# Altium project UHF_Reader_MultiFunction_V4.PrjPcb
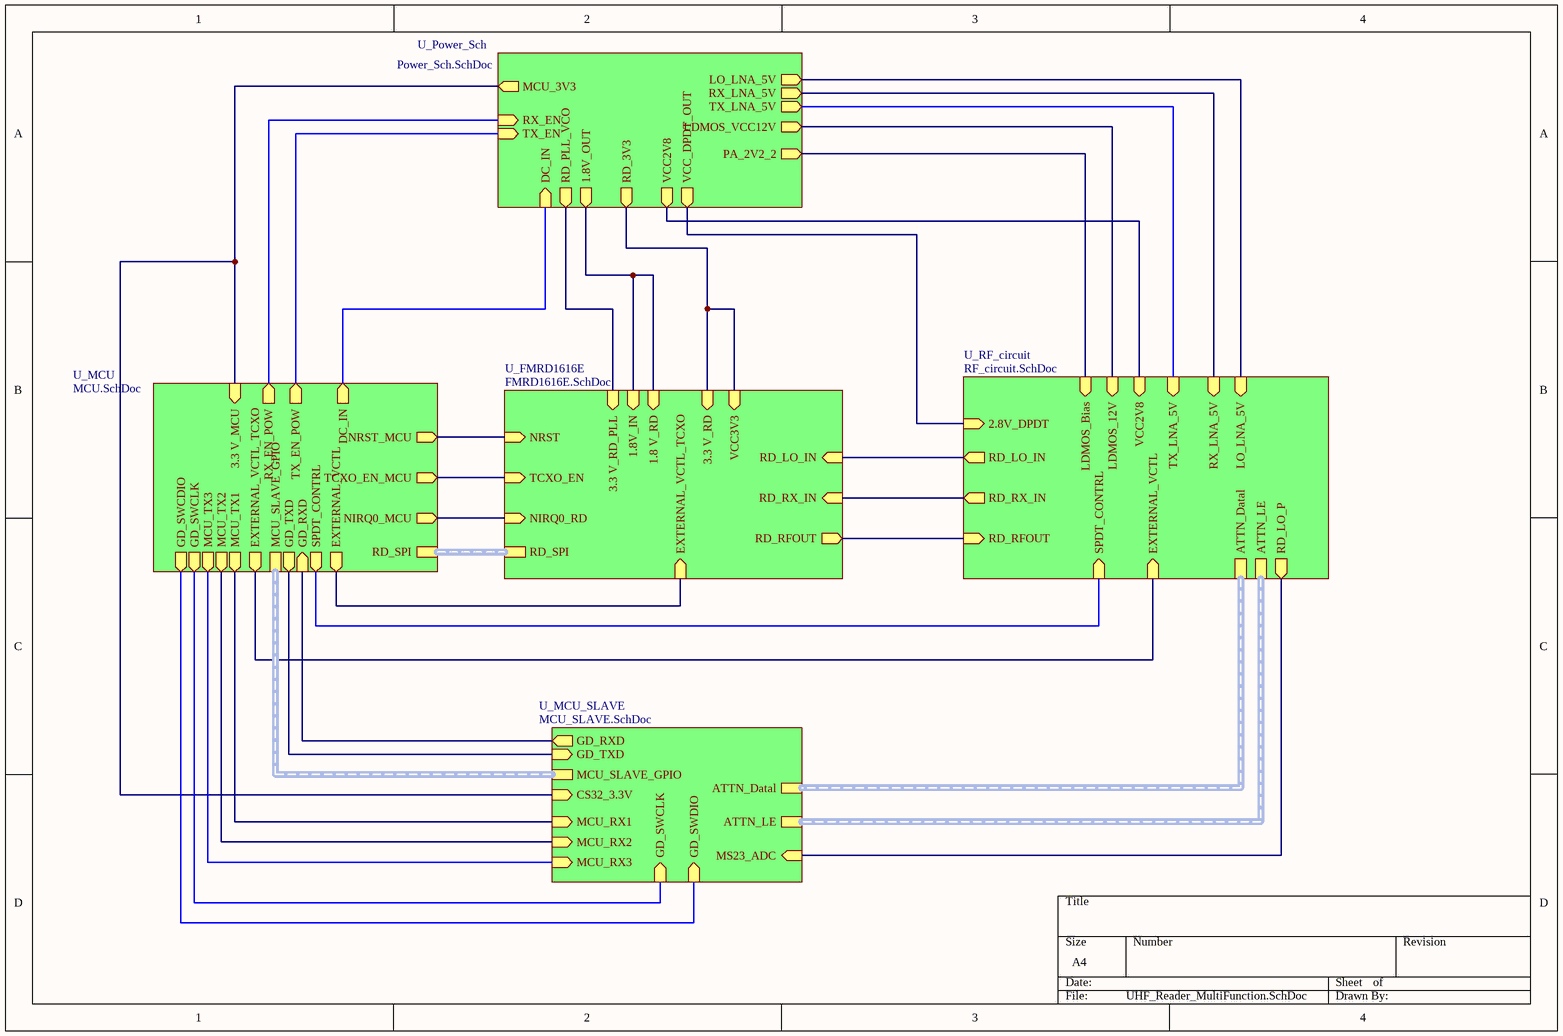
[diagram p0: UHF_Reader_MultiFunction.SchDoc]
6 sheets, 381 parts. Net scope: hierarchical (ports join the sheet entries above them; power ports are global).
Board file: UHF_Reader_MultiFunction_V4.PcbDoc
Sheets:
  UHF_Reader_MultiFunction.SchDoc
    U_FMRD1616E = FMRD1616E.SchDoc
    U_RF_circuit = RF_circuit.SchDoc
    U_MCU = MCU.SchDoc
    U_Power_Sch = Power_Sch.SchDoc
    U_MCU_SLAVE = MCU_SLAVE.SchDoc

## Sheet UHF_Reader_MultiFunction.SchDoc
size A4; SheetNumber: 1; SheetTotal: 6

### Sub-sheets
U_FMRD1616E = FMRD1616E.SchDoc: RD_RFOUT (out), 1.8 V_RD (in), NRST (in), TCXO_EN (in), NIRQ0_RD (in), 3.3 V_RD (in), RD_RX_IN (in), RD_LO_IN (in), RD_SPI (harness RD_SPI), 3.3 V_RD_PLL (in), VCC3V3 (in), 1.8V_IN (in), EXTERNAL_VCTL_TCXO (in)
U_MCU = MCU.SchDoc: 3.3 V_MCU (in), NRST_MCU (out), TCXO_EN_MCU (out), NIRQ0_MCU (out), RD_SPI (harness RD_SPI), MCU_TX1 (out), MCU_TX2 (out), DC_IN (out), SPDT_CONTRL (out), TX_EN_POW (out), RX_EN_POW (out), GD_SWCDIO (out), GD_SWCLK (out), MCU_TX3 (out), MCU_SLAVE_GPIO (harness MCU_SLAVE_OUT), EXTERNAL_VCTL_TCXO (out), EXTERNAL_VCTL (out), GD_TXD (out), GD_RXD (in)
U_MCU_SLAVE = MCU_SLAVE.SchDoc: CS32_3.3V (in), ATTN_Datal (harness ATTN1), ATTN_LE (harness ATTN_LE), MCU_RX1 (in), MCU_RX2 (in), MS23_ADC (in), GD_SWCLK (in), GD_SWDIO (in), MCU_RX3 (in), MCU_SLAVE_GPIO (harness MCU_SLAVE_OUT), GD_TXD (in), GD_RXD (out)
U_Power_Sch = Power_Sch.SchDoc: MCU_3V3 (out), VCC2V8 (out), PA_2V2_2 (out), LDMOS_VCC12V (out), RD_3V3 (out), RD_PLL_VCO (out), LO_LNA_5V (out), RX_LNA_5V (out), DC_IN (in), RX_EN (in), TX_EN (in), TX_LNA_5V (out), 1.8V_OUT (out), VCC_DPDT_OUT (out)
U_RF_circuit = RF_circuit.SchDoc: RD_RFOUT (in), LDMOS_Bias (in), LDMOS_12V (in), RD_LO_IN (out), RD_RX_IN (out), VCC2V8 (in), RD_LO_P (out), RX_LNA_5V (in), LO_LNA_5V (in), ATTN_Datal (harness ATTN1), ATTN_LE (harness ATTN_LE), SPDT_CONTRL (in), TX_LNA_5V (in), EXTERNAL_VCTL (in), 2.8V_DPDT (in)

### Nets
MCU_3V3: sheet U_MCU/3.3 V_MCU, sheet U_Power_Sch/MCU_3V3, sheet U_MCU_SLAVE/CS32_3.3V
VCC_+1.8 V: sheet U_FMRD1616E/1.8 V_RD, sheet U_FMRD1616E/1.8V_IN, sheet U_Power_Sch/1.8V_OUT
VCC_+3.3 V: sheet U_FMRD1616E/3.3 V_RD, sheet U_FMRD1616E/VCC3V3, sheet U_Power_Sch/RD_3V3
VCC_SGM_SPDT: sheet U_RF_circuit/VCC2V8, sheet U_Power_Sch/VCC2V8
VDD_DPDT: sheet U_RF_circuit/2.8V_DPDT, sheet U_Power_Sch/VCC_DPDT_OUT
ADP_IN: sheet U_RF_circuit/LDMOS_12V, sheet U_Power_Sch/LDMOS_VCC12V
LNA_5V: sheet U_RF_circuit/RX_LNA_5V, sheet U_Power_Sch/RX_LNA_5V
LO_LNA_5V: sheet U_RF_circuit/LO_LNA_5V, sheet U_Power_Sch/LO_LNA_5V
NIRQ0: sheet U_FMRD1616E/NIRQ0_RD, sheet U_MCU/NIRQ0_MCU
PA0: sheet U_RF_circuit/RD_LO_P, sheet U_MCU_SLAVE/MS23_ADC
PA3: sheet U_MCU/MCU_TX1, sheet U_MCU_SLAVE/MCU_RX1
PA4: sheet U_MCU/MCU_TX2, sheet U_MCU_SLAVE/MCU_RX2
PA13: sheet U_MCU/GD_SWCDIO, sheet U_MCU_SLAVE/GD_SWDIO
PA14: sheet U_MCU/GD_SWCLK, sheet U_MCU_SLAVE/GD_SWCLK
PB6: sheet U_MCU/GD_TXD, sheet U_MCU_SLAVE/GD_TXD
PB7: sheet U_MCU/GD_RXD, sheet U_MCU_SLAVE/GD_RXD
PE1: sheet U_MCU/MCU_TX3, sheet U_MCU_SLAVE/MCU_RX3
TCXO_EN: sheet U_FMRD1616E/TCXO_EN, sheet U_MCU/TCXO_EN_MCU
TX_EN: sheet U_MCU/TX_EN_POW, sheet U_Power_Sch/TX_EN
V4_MCU: sheet U_RF_circuit/SPDT_CONTRL, sheet U_MCU/SPDT_CONTRL
NetC89_2: sheet U_RF_circuit/TX_LNA_5V, sheet U_Power_Sch/TX_LNA_5V
NetC92_2: sheet U_RF_circuit/LDMOS_Bias, sheet U_Power_Sch/PA_2V2_2
NetC179_1: sheet U_FMRD1616E/RD_LO_IN, sheet U_RF_circuit/RD_LO_IN
NetC180_1: sheet U_FMRD1616E/RD_RX_IN, sheet U_RF_circuit/RD_RX_IN
NetC207_1: sheet U_FMRD1616E/3.3 V_RD_PLL, sheet U_Power_Sch/RD_PLL_VCO
NetF1_1: sheet U_MCU/DC_IN, sheet U_Power_Sch/DC_IN
NetR11_1: sheet U_FMRD1616E/NRST, sheet U_MCU/NRST_MCU
NetR22_1: sheet U_FMRD1616E/EXTERNAL_VCTL_TCXO, sheet U_MCU/EXTERNAL_VCTL
NetR24_1: sheet U_RF_circuit/EXTERNAL_VCTL, sheet U_MCU/EXTERNAL_VCTL_TCXO
NetR29_1: sheet U_FMRD1616E/RD_RFOUT, sheet U_RF_circuit/RD_RFOUT
NetU1_9: sheet U_MCU/RX_EN_POW, sheet U_Power_Sch/RX_EN

### Buses and harness runs
harness sheet U_FMRD1616E/RD_SPI = sheet U_MCU/RD_SPI
harness sheet U_MCU/MCU_SLAVE_GPIO = sheet U_MCU_SLAVE/MCU_SLAVE_GPIO
harness sheet U_MCU_SLAVE/ATTN_Datal = sheet U_RF_circuit/ATTN_Datal
harness sheet U_MCU_SLAVE/ATTN_LE = sheet U_RF_circuit/ATTN_LE

## Sheet FMRD1616E.SchDoc: FM13RD1616E
size A2; Date: 2025-07-03; SheetNumber: 3; SheetTotal: 6
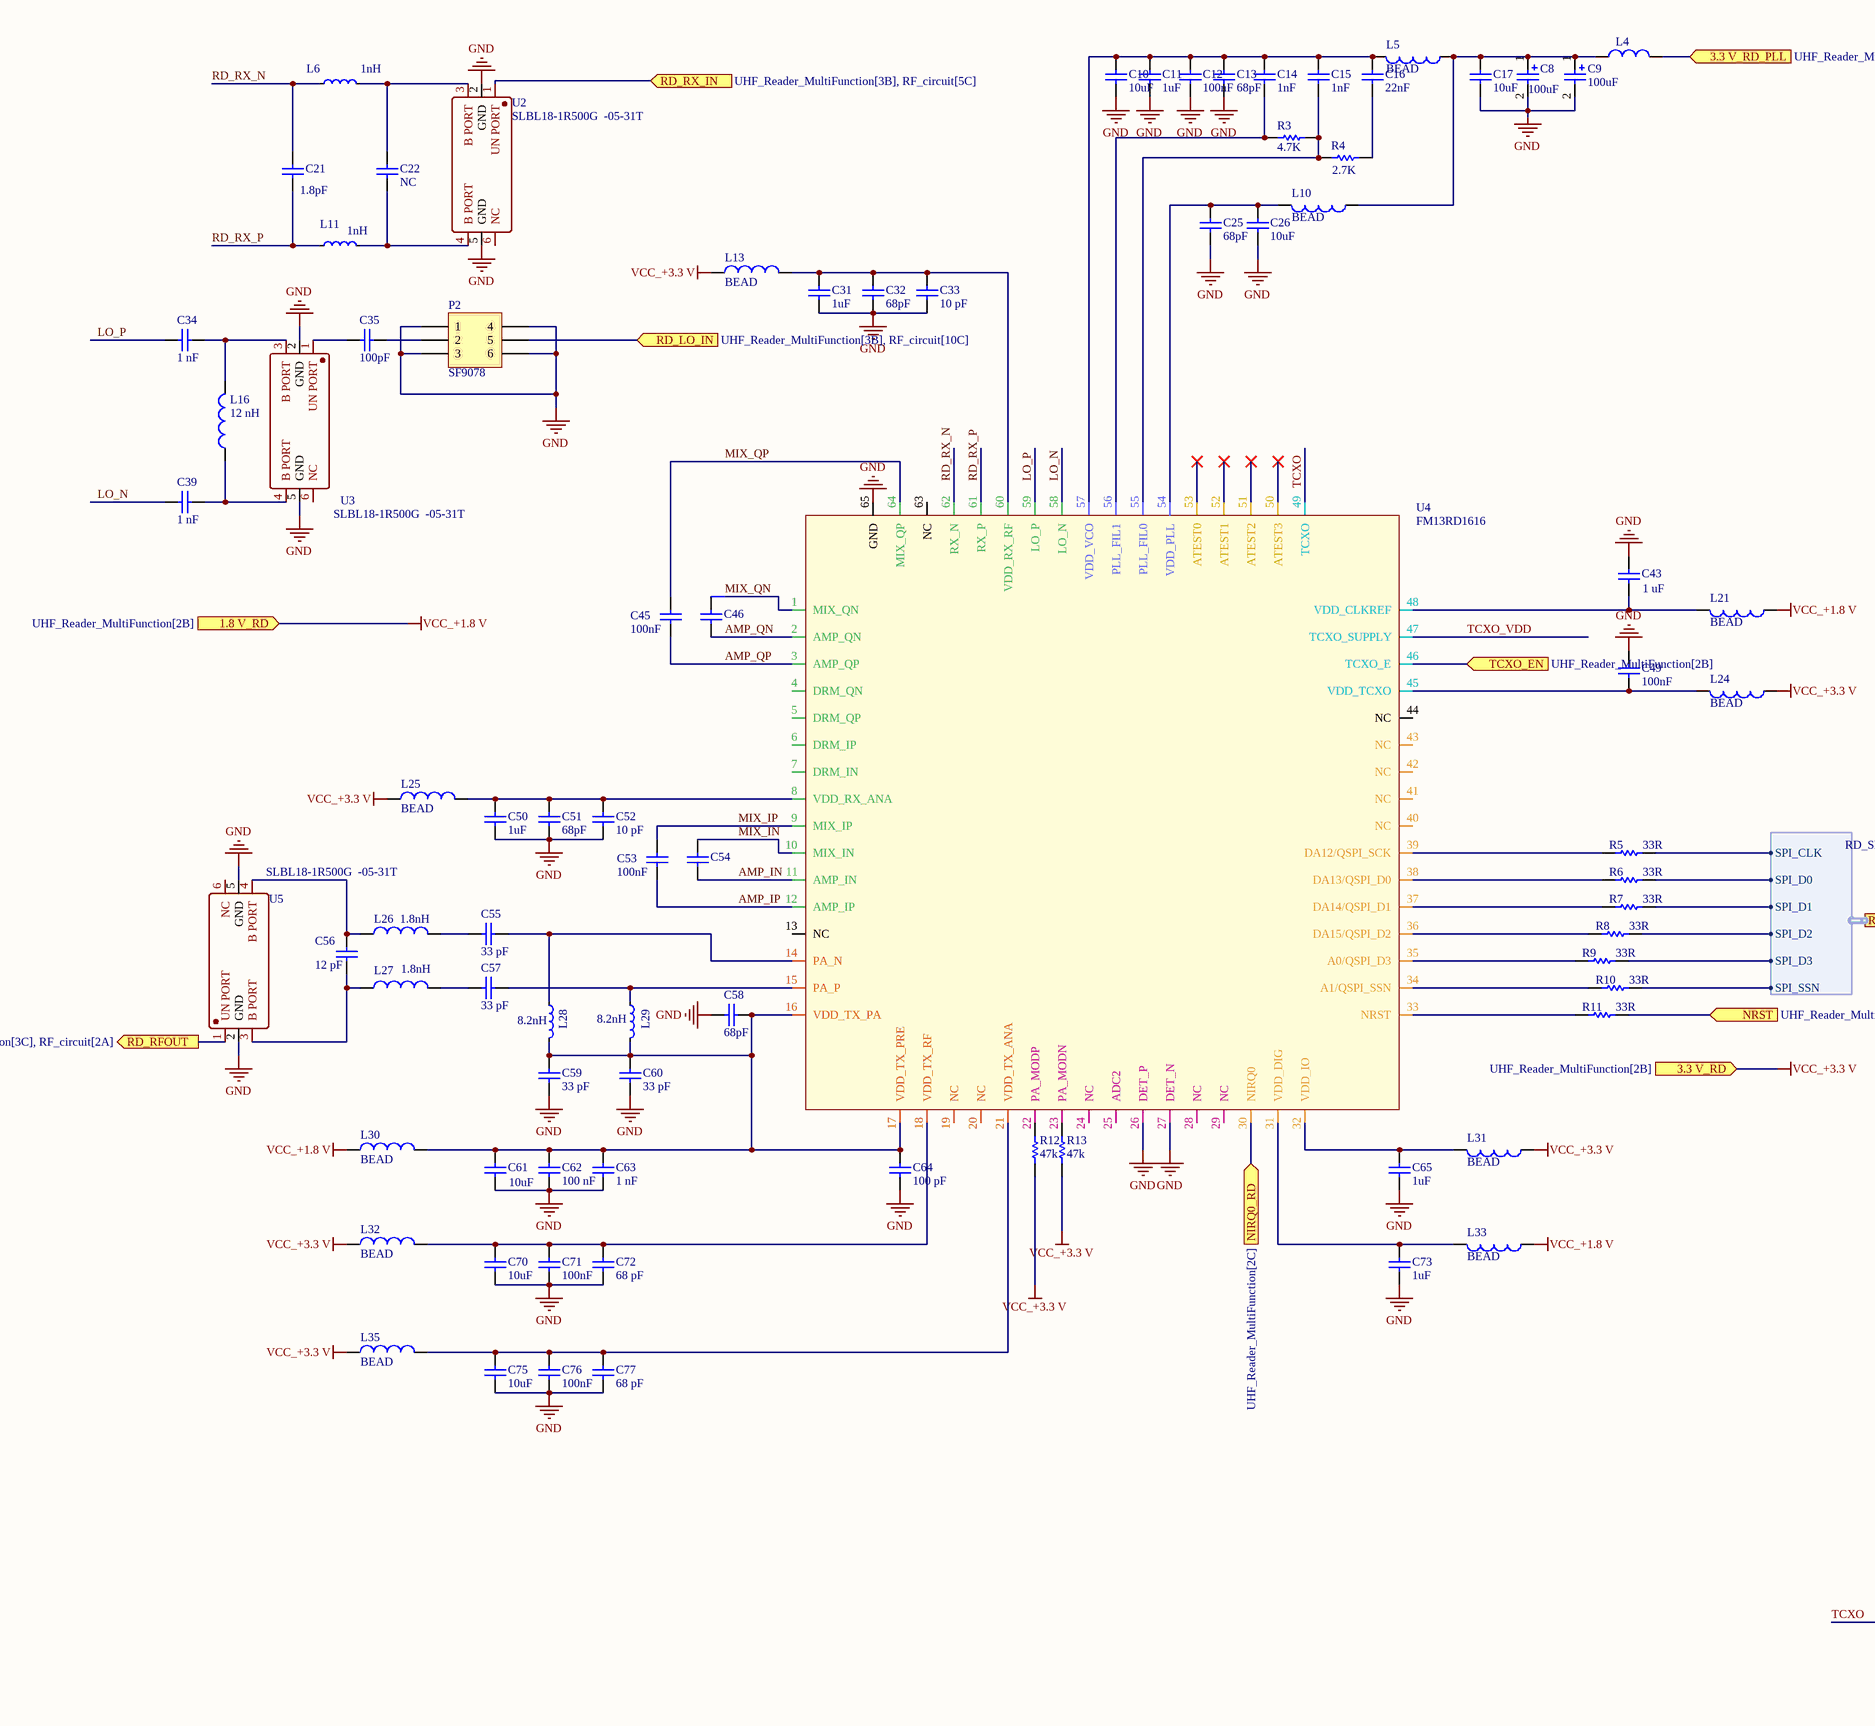
[diagram p1: FMRD1616E.SchDoc, left]
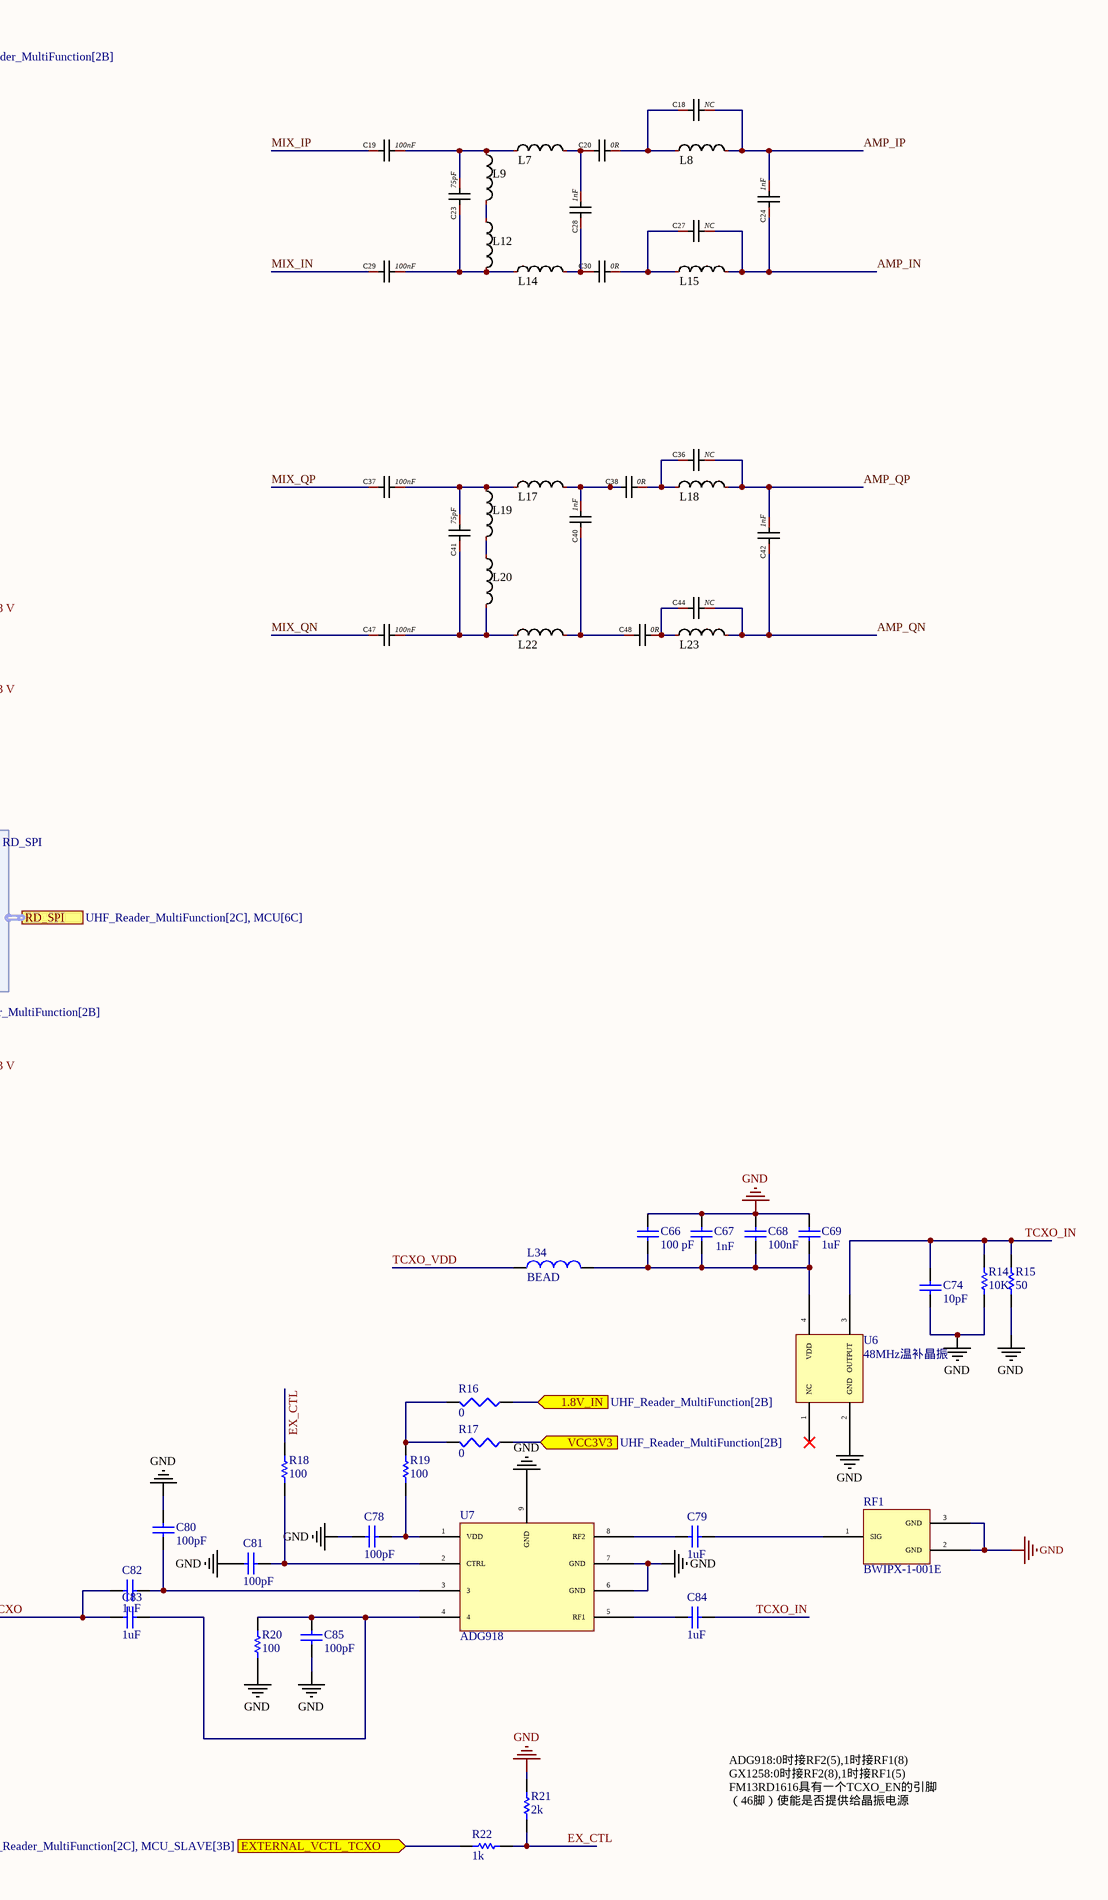
[diagram p2: FMRD1616E.SchDoc, right]

### Parts
C8  100uF  [0805_Z]
C9  100uF  [0805_Z]
C10  10uF  [0402_Z]
C11  1uF  [0402_Z]
C12  100nF  [0402_Z]
C13  68pF  [0402_Z]
C14  1nF  [0402_Z]
C15  1nF  [0402_Z]
C16  22nF  [0402_Z]
C17  10uF  [0603_Z]
C18  NC  [0402_Z]
C19  100nF  [0402_Z]
C20  0R  [0402_Z]
C21  1.8pF  [0402_Z]
C22  NC  [0402_Z]
C23  75pF  [0402_Z]
C24  1nF  [0402_Z]
C25  68pF  [0402_Z]
C26  10uF  [0603_Z]
C27  NC  [0402_Z]
C28  1nF  [0402_Z]
C29  100nF  [0402_Z]
C30  0R  [0402_Z]
C31  1uF  [0402_Z]
C32  68pF  [0402_Z]
C33  10 pF  [0402_Z]
C34  1 nF  [0402_Z]
C35  100pF  [0402_Z]
C36  NC  [0402_Z]
C37  100nF  [0402_Z]
C38  0R  [0402_Z]
C39  1 nF  [0402_Z]
C40  1nF  [0402_Z]
C41  75pF  [0402_Z]
C42  1nF  [0402_Z]
C43  1 uF  [0402_Z]
C44  NC  [0402_Z]
C45  100nF  [0402_Z]
C46  100nF  [0402_Z]  (value not drawn)
C47  100nF  [0402_Z]
C48  0R  [0402_Z]
C49  100nF  [0402_Z]
C50  1uF  [0402_Z]
C51  68pF  [0402_Z]
C52  10 pF  [0402_Z]
C53  100nF  [0402_Z]
C54  100nF  [0402_Z]  (value not drawn)
C55  33 pF  [0402_Z]
C56  12 pF  [0402_Z]
C57  33 pF  [0402_Z]
C58  68pF  [0402_Z]
C59  33 pF  [0402_Z]
C60  33 pF  [0402_Z]
C61  10uF  [0603_Z]
C62  100 nF  [0402_Z]
C63  1 nF  [0402_Z]
C64  100 pF  [0402_Z]
C65  1uF  [0402_Z]
C66  100 pF  [0402_Z]
C67  1nF  [0402_Z]
C68  100nF  [0402_Z]
C69  1uF  [0603_Z]
C70  10uF  [0603_Z]
C71  100nF  [0402_Z]
C72  68 pF  [0402_Z]
C73  1uF  [0402_Z]
C74  10pF  [0402_Z]
C75  10uF  [0603_Z]
C76  100nF  [0402_Z]
C77  68 pF  [0402_Z]
C78  100pF  [0402_Z]
C79  1uF  [0402_Z]
C80  100pF  [0402_Z]
C81  100pF  [0402_Z]
C82  1uF  [0402_Z]
C83  1uF  [0402_Z]
C84  1uF  [0402_Z]
C85  100pF  [0402_Z]
L4  (no value)  [0603_Z]
L5  BEAD  [0603_Z]
L6  1nH  [0402_Z]
L7  270uH  [1210_Z]  (value not drawn)
L8  390uH  [1210_Z]  (value not drawn)
L9  NC  [1210_Z]  (value not drawn)
L10  BEAD  [0603_Z]
L11  1nH  [0402_Z]
L12  NC  [1210_Z]  (value not drawn)
L13  BEAD  [0603_Z]
L14  270uH  [1210_Z]  (value not drawn)
L15  390uH  [1210_Z]  (value not drawn)
L16  12 nH  [0402_Z]
L17  270uH  [1210_Z]  (value not drawn)
L18  390uH  [1210_Z]  (value not drawn)
L19  NC  [1210_Z]  (value not drawn)
L20  NC  [1210_Z]  (value not drawn)
L21  BEAD  [0603_Z]
L22  270uH  [1210_Z]  (value not drawn)
L23  390uH  [1210_Z]  (value not drawn)
L24  BEAD  [0603_Z]
L25  BEAD  [0603_Z]
L26  1.8nH  [0402_Z]
L27  1.8nH  [0402_Z]
L28  8.2nH  [0402_Z]
L29  8.2nH  [0402_Z]
L30  BEAD  [0603_Z]
L31  BEAD  [0603_Z]
L32  BEAD  [0603_Z]
L33  BEAD  [0603_Z]
L34  BEAD  [0603_Z]
L35  BEAD  [0603_Z]
P2  SF9078  [SF8009]
R3  4.7K  [0402_Z]
R4  2.7K  [0402_Z]
R5  33R  [0402_Z]
R6  33R  [0402_Z]
R7  33R  [0402_Z]
R8  33R  [0402_Z]
R9  33R  [0402_Z]
R10  33R  [0402_Z]
R11  33R  [0402_Z]
R12  47k  [0402_Z]
R13  47k  [0402_Z]
R14  10K  [0402_Z]
R15  50  [0402_Z]
R16  0  [0402_Z]
R17  0  [0402_Z]
R18  100  [0402_Z]
R19  100  [0402_Z]
R20  100  [0402_Z]
R21  2k  [0402_Z]
R22  1k  [0402_Z]
RF1  BWIPX-1-001E  [IPEX-SMD_BWIPX-1-001E]
U2  SLBL18-1R500G  -05-31T  [Balun-0900BL15C050]
U3  SLBL18-1R500G  -05-31T  [Balun-0900BL15C050]
U4  FM13RD1616  [FM13RD1616E]
U5  SLBL18-1R500G  -05-31T  [Balun-0900BL15C050]
U6  48MHz温补晶振  [48MH温补晶振]
U7  ADG918  [ADG918]

### Ports
1.8 V_RD (in, see UHF_Reader_MultiFunction[2B]), 1.8V_IN (in, see UHF_Reader_MultiFunction[2B]), 3.3 V_RD (in, see UHF_Reader_MultiFunction[2B]), 3.3 V_RD_PLL (in, see UHF_Reader_MultiFunction[2B]), EXTERNAL_VCTL_TCXO (in, see UHF_Reader_MultiFunction[2C], MCU_SLAVE[3B]), NIRQ0_RD (in, see UHF_Reader_MultiFunction[2C]), NRST (in, see UHF_Reader_MultiFunction[2B]), RD_LO_IN (in, see UHF_Reader_MultiFunction[3B], RF_circuit[10C]), RD_RFOUT (out, see UHF_Reader_MultiFunction[3C], RF_circuit[2A]), RD_RX_IN (in, see UHF_Reader_MultiFunction[3B], RF_circuit[5C]), RD_SPI (harness RD_SPI, see UHF_Reader_MultiFunction[2C], MCU[6C]), TCXO_EN (in, see UHF_Reader_MultiFunction[2B]), VCC3V3 (in, see UHF_Reader_MultiFunction[2B])

### Harnesses
RD_SPI: SPI_SSN, SPI_D3, SPI_D2, SPI_D1, SPI_D0, SPI_CLK

### Nets
GND: C8.2 C9.2 C10.1 C11.1 C12.1 C13.1 C17.1 C25.1 C26.1 C31.1 C32.1 C33.1 C43.1 C49.1 C50.1 C51.1 C52.1 C58.2 C59.1 C60.2 C61.1 C62.1 C63.1 C64.2 C65.2 C66.1 C67.1 C68.1 C69.1 C70.1 C71.1 C72.1 C73.2 C74.2 C75.1 C76.1 C77.1 C78.1 C80.2 C81.1 C85.1 P2.1 P2.3 P2.4 P2.6 R14.2 R15.2 R20.1 R21.1 RF1.2(GND) RF1.3(GND) U2.2(GND) U2.5(GND) U3.2(GND) U3.5(GND) U4.26(DET_P) U4.27(DET_N) U4.65(GND) U5.2(GND) U5.5(GND) U6.2(GND) U7.6(GND) U7.7(GND) U7.9(GND)
VCC_+1.8 V: L21.1 L30.1 L33.1 R16.1 ; port 1.8 V_RD, port 1.8V_IN
VCC_+3.3 V: L13.1 L24.1 L25.1 L31.1 L32.1 L35.1 R12.1 R13.1 R17.1 ; port 3.3 V_RD, port VCC3V3
AMP_IN: C24.1 C27.2 C54.2 L15.2 U4.11(AMP_IN)
AMP_IP: C18.2 C24.2 C53.2 L8.2 U4.12(AMP_IP)
AMP_QN: C42.1 C44.2 C46.2 L23.2 U4.2(AMP_QN)
AMP_QP: C36.2 C42.2 C45.2 L18.2 U4.3(AMP_QP)
EX_CTL: R18.1 R21.2 R22.2
LO_N: C39.1 U4.58(LO_N)
LO_P: C34.1 U4.59(LO_P)
MIX_IN: C29.1 C54.1 U4.10(MIX_IN)
MIX_IP: C19.1 C53.1 U4.9(MIX_IP)
MIX_QN: C46.1 C47.1 U4.1(MIX_QN)
MIX_QP: C37.1 C45.1 U4.64(MIX_QP)
NIRQ0: U4.30(NIRQ0) ; port NIRQ0_RD
QSPI_D0: R6.1 ; port RD_SPI.SPI_D0
QSPI_D1: R7.1 ; port RD_SPI.SPI_D1
QSPI_D2: R8.1 ; port RD_SPI.SPI_D2
QSPI_D3: R9.1 ; port RD_SPI.SPI_D3
QSPI_SCK: R5.1 ; port RD_SPI.SPI_CLK
QSPI_SSN: R10.1 ; port RD_SPI.SPI_SSN
RD_RX_N: C21.2 L6.1 U4.62(RX_N)
RD_RX_P: C21.1 L11.1 U4.61(RX_P)
TCXO: C82.1 C83.1 U4.49(TCXO)
TCXO_EN: U4.46(TCXO_E) ; port TCXO_EN
TCXO_IN: C74.1 C84.2 R14.1 R15.1 U6.3(OUTPUT)
TCXO_VDD: L34.1 U4.47(TCXO_SUPPLY)
NetC8_1: C8.1 C9.1 C17.2 L4.1 L5.1 L10.1
NetC10_2: C10.2 C11.2 C12.2 C13.2 C14.2 C15.2 C16.2 L5.2 U4.57(VDD_VCO)
NetC14_1: C14.1 R3.1 U4.56(PLL_FIL1)
NetC15_1: C15.1 R3.2 R4.1 U4.55(PLL_FIL0)
NetC16_1: C16.1 R4.2
NetC18_1: C18.1 C20.2 L8.1
NetC19_2: C19.2 C23.2 L7.1 L9.1
NetC20_1: C20.1 C28.2 L7.2
NetC22_1: C22.1 L11.2 U2.4(B_PORT)
NetC22_2: C22.2 L6.2 U2.3(B_PORT)
NetC23_1: C23.1 C29.2 L12.2 L14.1
NetC25_2: C25.2 C26.2 L10.2 U4.54(VDD_PLL)
NetC27_1: C27.1 C30.2 L15.1
NetC28_1: C28.1 C30.1 L14.2
NetC31_2: C31.2 C32.2 C33.2 L13.2 U4.60(VDD_RX_RF)
NetC34_2: C34.2 L16.2 U3.3(B_PORT)
NetC35_1: C35.1 U3.1(UN_PORT)
NetC35_2: C35.2 P2.2
NetC36_1: C36.1 C38.2 L18.1
NetC37_2: C37.2 C41.2 L17.1 L19.1
NetC38_1: C38.1 C40.2 L17.2
NetC39_2: C39.2 L16.1 U3.4(B_PORT)
NetC40_1: C40.1 C48.1 L22.2
NetC41_1: C41.1 C47.2 L20.2 L22.1
NetC43_2: C43.2 L21.2 U4.48(VDD_CLKREF)
NetC44_1: C44.1 C48.2 L23.1
NetC49_2: C49.2 L24.2 U4.45(VDD_TCXO)
NetC50_2: C50.2 C51.2 C52.2 L25.2 U4.8(VDD_RX_ANA)
NetC55_1: C55.1 L28.1 U4.14(PA_N)
NetC55_2: C55.2 L26.2
NetC56_1: C56.1 L26.1 U5.4(B_PORT)
NetC56_2: C56.2 L27.1 U5.3(B_PORT)
NetC57_1: C57.1 L29.1 U4.15(PA_P)
NetC57_2: C57.2 L27.2
NetC58_1: C58.1 C59.2 C60.1 C61.2 C62.2 C63.2 C64.1 L28.2 L29.2 L30.2 U4.16(VDD_TX_PA) U4.17(VDD_TX_PRE)
NetC65_1: C65.1 L31.2 U4.32(VDD_IO)
NetC66_2: C66.2 C67.2 C68.2 C69.2 L34.2 U6.4(VDD)
NetC70_2: C70.2 C71.2 C72.2 L32.2 U4.18(VDD_TX_RF)
NetC73_1: C73.1 L33.2 U4.31(VDD_DIG)
NetC75_2: C75.2 C76.2 C77.2 L35.2 U4.21(VDD_TX_ANA)
NetC78_2: C78.2 R19.2 U7.1(VDD)
NetC79_1: C79.1 RF1.1(SIG)
NetC79_2: C79.2 U7.8(RF2)
NetC80_1: C80.1 C82.2 U7.3
NetC81_2: C81.2 R18.2 U7.2(CTRL)
NetC83_2: C83.2 C85.2 R20.2 U7.4
NetC84_1: C84.1 U7.5(RF1)
NetC179_1: P2.5 ; port RD_LO_IN
NetC180_1: U2.1(UN_PORT) ; port RD_RX_IN
NetC207_1: L4.2 ; port 3.3 V_RD_PLL
NetL9_2: L9.2 L12.1
NetL19_2: L19.2 L20.1
NetR5_2: R5.2 U4.39(DA12/QSPI_SCK)
NetR6_2: R6.2 U4.38(DA13/QSPI_D0)
NetR7_2: R7.2 U4.37(DA14/QSPI_D1)
NetR8_2: R8.2 U4.36(DA15/QSPI_D2)
NetR9_2: R9.2 U4.35(A0/QSPI_D3)
NetR10_2: R10.2 U4.34(A1/QSPI_SSN)
NetR11_1: R11.1 ; port NRST
NetR11_2: R11.2 U4.33(NRST)
NetR12_2: R12.2 U4.22(PA_MODP)
NetR13_2: R13.2 U4.23(PA_MODN)
NetR16_2: R16.2 R17.2 R19.1
NetR22_1: R22.1 ; port EXTERNAL_VCTL_TCXO
NetR29_1: U5.1(UN_PORT) ; port RD_RFOUT

Not connected (* = marked no-connect by the designer): U2 6(NC); U3 6(NC); U4 4(DRM_QN) 5(DRM_QP) 6(DRM_IP) 7(DRM_IN) 13(NC) 19(NC) 20(NC) 24(NC) 25(ADC2) 28(NC) 29(NC) 40(NC) 41(NC) 42(NC) 43(NC) 44(NC) 50(ATEST3)* 51(ATEST2)* 52(ATEST1)* 53(ATEST0)* 63(NC); U5 6(NC); U6 1(NC)*

### Notes on the sheet
- ADG918:0时接RF2(5),1时接RF1(8)
  GX1258:0时接RF2(8),1时接RF1(5)
  FM13RD1616具有一个TCXO_EN的引脚（46脚）使能是否提供给晶振电源

### Library data of the parts
C8 C9 = Cap Pol1: Polarized Capacitor (Radial); Published: 8-Jun-2000; LatestRevisionDate: 17-Jul-2002; LatestRevisionNote: Re-released for DXP Platform.; PackageReference: RB7.6-15; Publisher: Altium Limited; Value: 100uF
C10-C17 C25 C26 C35 C45 C46 C53 C54 C78 C80 C81 C85 = Cap: Capacitor; Published: 8-Jun-2000; LatestRevisionDate: 17-Jul-2002; LatestRevisionNote: Re-released for DXP Platform.; PackageReference: RAD-0.3; Publisher: Altium Limited
  C10 C17 C26: Value: 10uF
  C11: Value: 1uF
  C12 C45 C46 C53 C54: Value: 100nF
  C13 C25: Value: 68pF
  C14 C15: Value: 1nF
  C16: Value: 22nF
  C35 C78 C80 C81 C85: PackageDescription: Radial Cap, Thru-Hole; 2 Leads; 0.3 in Pin Spacing; Value: 100pF
C18-C20 C23 C24 C27-C30 C36-C38 C40-C42 C44 C47 C48 = Cap
C21 C22 C31-C34 C39 C43 C49-C52 C55-C77 C79 C82-C84 = Cap: Capacitor; Value: 100pF; Published: 8-Jun-2000; LatestRevisionDate: 17-Jul-2002; LatestRevisionNote: Re-released for DXP Platform.; PackageReference: RAD-0.3; Publisher: Altium Limited; PackageDescription: Radial Cap, Thru-Hole; 2 Leads; 0.3 in Pin Spacing
L4 = INDUCTOR1: INDUCTOR; Value: 33nH
L5 L10 L13 L16 L21 L24-L27 L30-L35 = Inductor: Code_IEC: 1005; Value: 10mH; Published: 8-Jun-2000; LatestRevisionDate: 29-May-2009; LatestRevisionNote: IPC-7351 Footprint Added.; PackageReference: 0402-A; Publisher: Altium Limited; PackageDescription: Chip Inductor; Code_JEITA: 0402
L6 L11 L28 L29 = IND: Inductor, 80mA, ±10%; Part Number: L0603-10µ; Manufacturer: Taiyo Yuden; Manufacturer Part Number: LBMF1608T100K; 2nd source part number: 178-6105; Note: LBMF1608T100K 10µH 80mA 0603; Artikkelnr Noca: 33029314; Artikkelnr Simpro: N.A.; Datasheet: http://www.yuden.co.jp/ut/product/pdf/elb2_e.pdf; LatestRevisionDate: 2012-09-19; Pin Count: 2; Publisher: Nordic Semiconductor; Published: 2010-02-24; Supplier: Digi-Key; Supplier part number: 587-1714-1-ND; 2nd source Supplier: Farnell; Footprint Doc: 0603; ComponentLink1Description: Datasheet; ComponentLink2Description: Supplier link
  L6 L11: Value: 1nH
  L28 L29: Value: 8.2nH
L7-L9 L12 L14 L15 L17-L20 L22 L23 = 470uH大电感: Manufacturer: FH(风华); Name: 470uH; Symbol: FHW1210IF471KST; Add into BOM: yes; Value: 470uH; Tolerance: ±10%; Rated Current: 40mA; DC Resistance (DCR): 22.5Ω; Q @ Freq: 8@796kHz; Frequency - Self Resonant: 2MHz; Device: FHW1210IF471KST; LCSC Part Name: 470uH ±10% 22.5Ω; Supplier Part: C75644; Manufacturer Part: FHW1210IF471KST; Supplier Footprint: 1210; JLCPCB Part Class: Extended Part; Datasheet: https://atta.szlcsc.com/upload/public/pdf/source/20230314/04CD9A2FDF314BADB654B282B27A36D2.pdf; Supplier: LCSC; Convert to PCB: yes; Saturation Current (Isat): -; Ratings: -
P2 = Header 3X2A: Header, 3-Pin, Dual row; LatestRevisionDate: 17-Jul-2002; LatestRevisionNote: Re-released for DXP Platform.; Publisher: Altium Limited
R3-R11 = Res1: Resistor; Published: 8-Jun-2000; Revision: July-2002: Re-released for DXP Platform.; Publisher: Altium Limited
  R3: Value: 4.7K
  R4: Value: 2.7K
  R5-R11: Value: 33R
R12 R13 = Res1: Resistor; Value: 1K; Published: 8-Jun-2000; LatestRevisionDate: 17-Jul-2002; LatestRevisionNote: Re-released for DXP Platform.; PackageReference: AXIAL-0.3; Publisher: Altium Limited; PackageDescription: Axial Device, Thru-Hole; 2 Leads; 0.3 in Pin Spacing
R14 R15 = Res: 0402; Value: 100R; Published: 8-Jun-2000; Revision: July-2002: Re-released for DXP Platform.; Publisher: Altium Limited
R16 R17 = Res3_14: Resistor; Published: 8-Jun-2000; LatestRevisionDate: 04-Mar-2005; LatestRevisionNote: PCB Footprint replaced.; PackageReference: J1-0603; Publisher: Altium Limited; Value: 0
R18-R20 = Resistor: Thick Film Resistor; Value: 2k
R21 R22 = Resistor: Thick Film Resistor
  R21: Value: 2k
  R22: Value: 1k

## Sheet RF_circuit.SchDoc
size A1; SheetNumber: 4; SheetTotal: 6
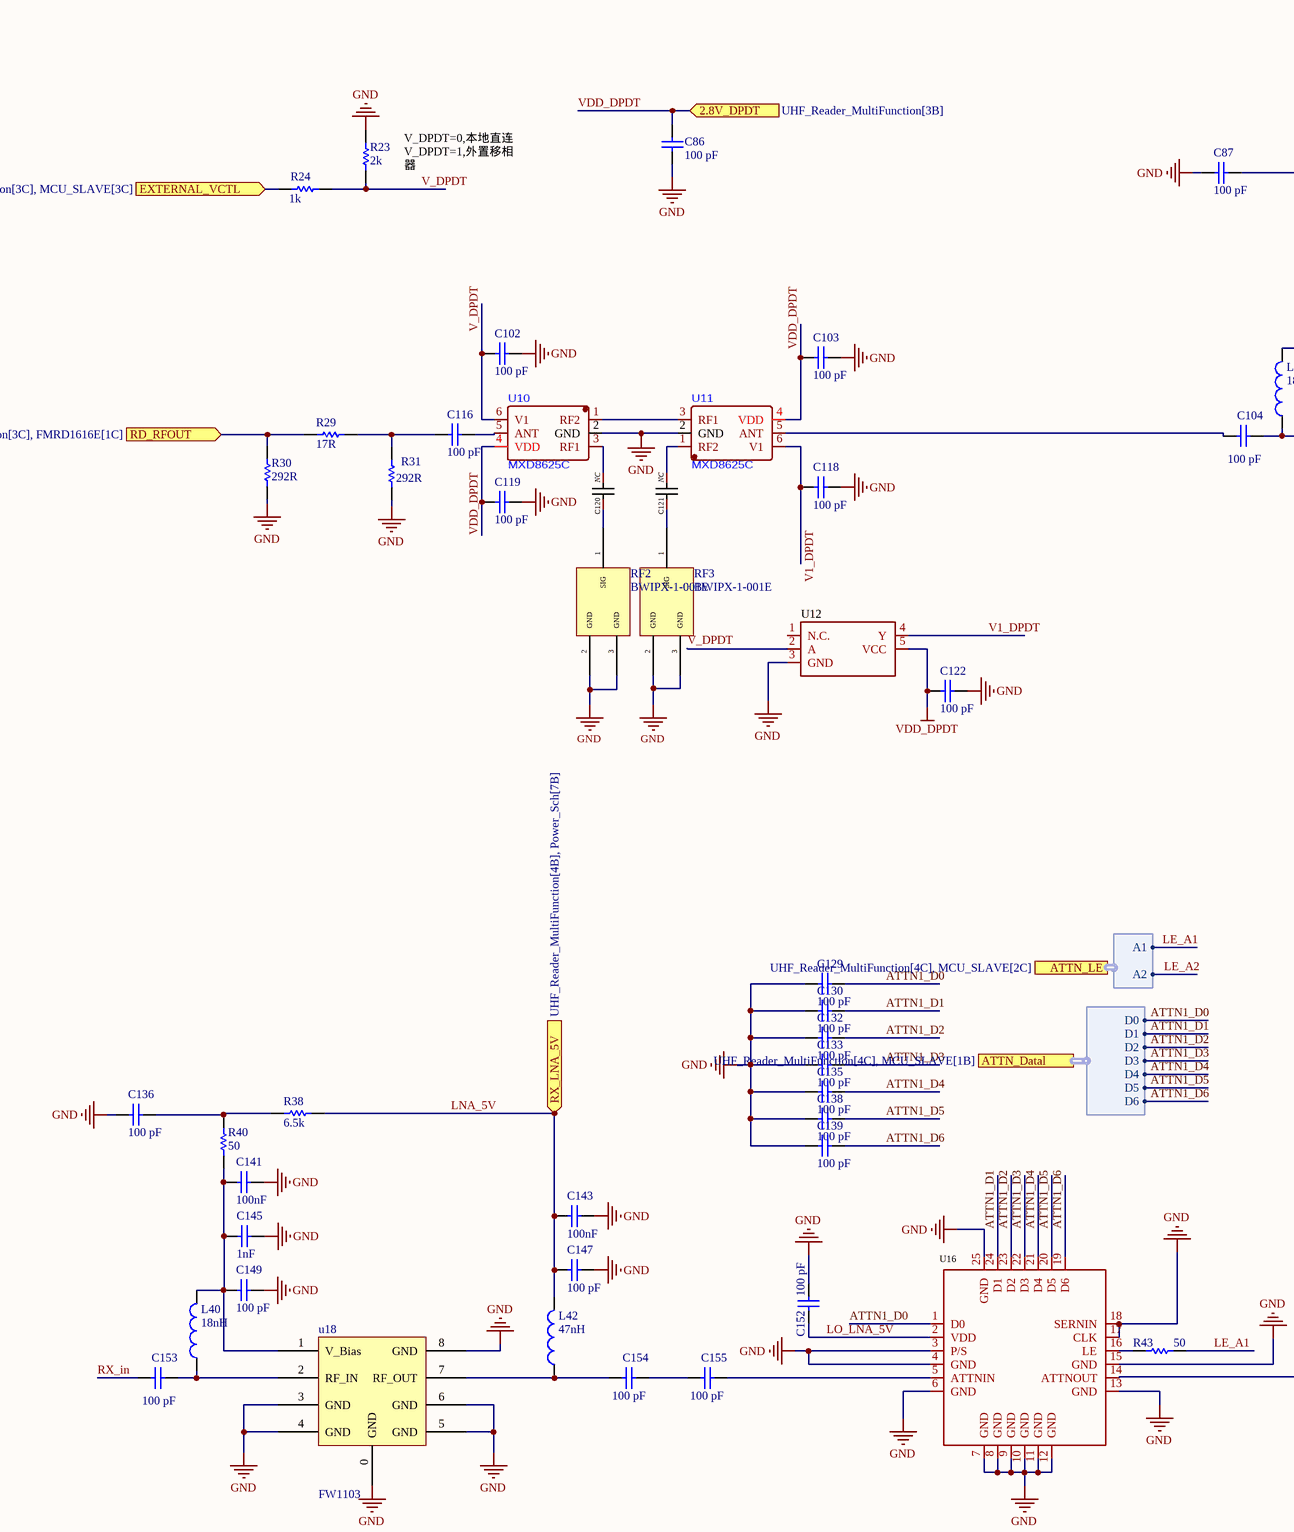
[diagram p3: RF_circuit.SchDoc, top left]
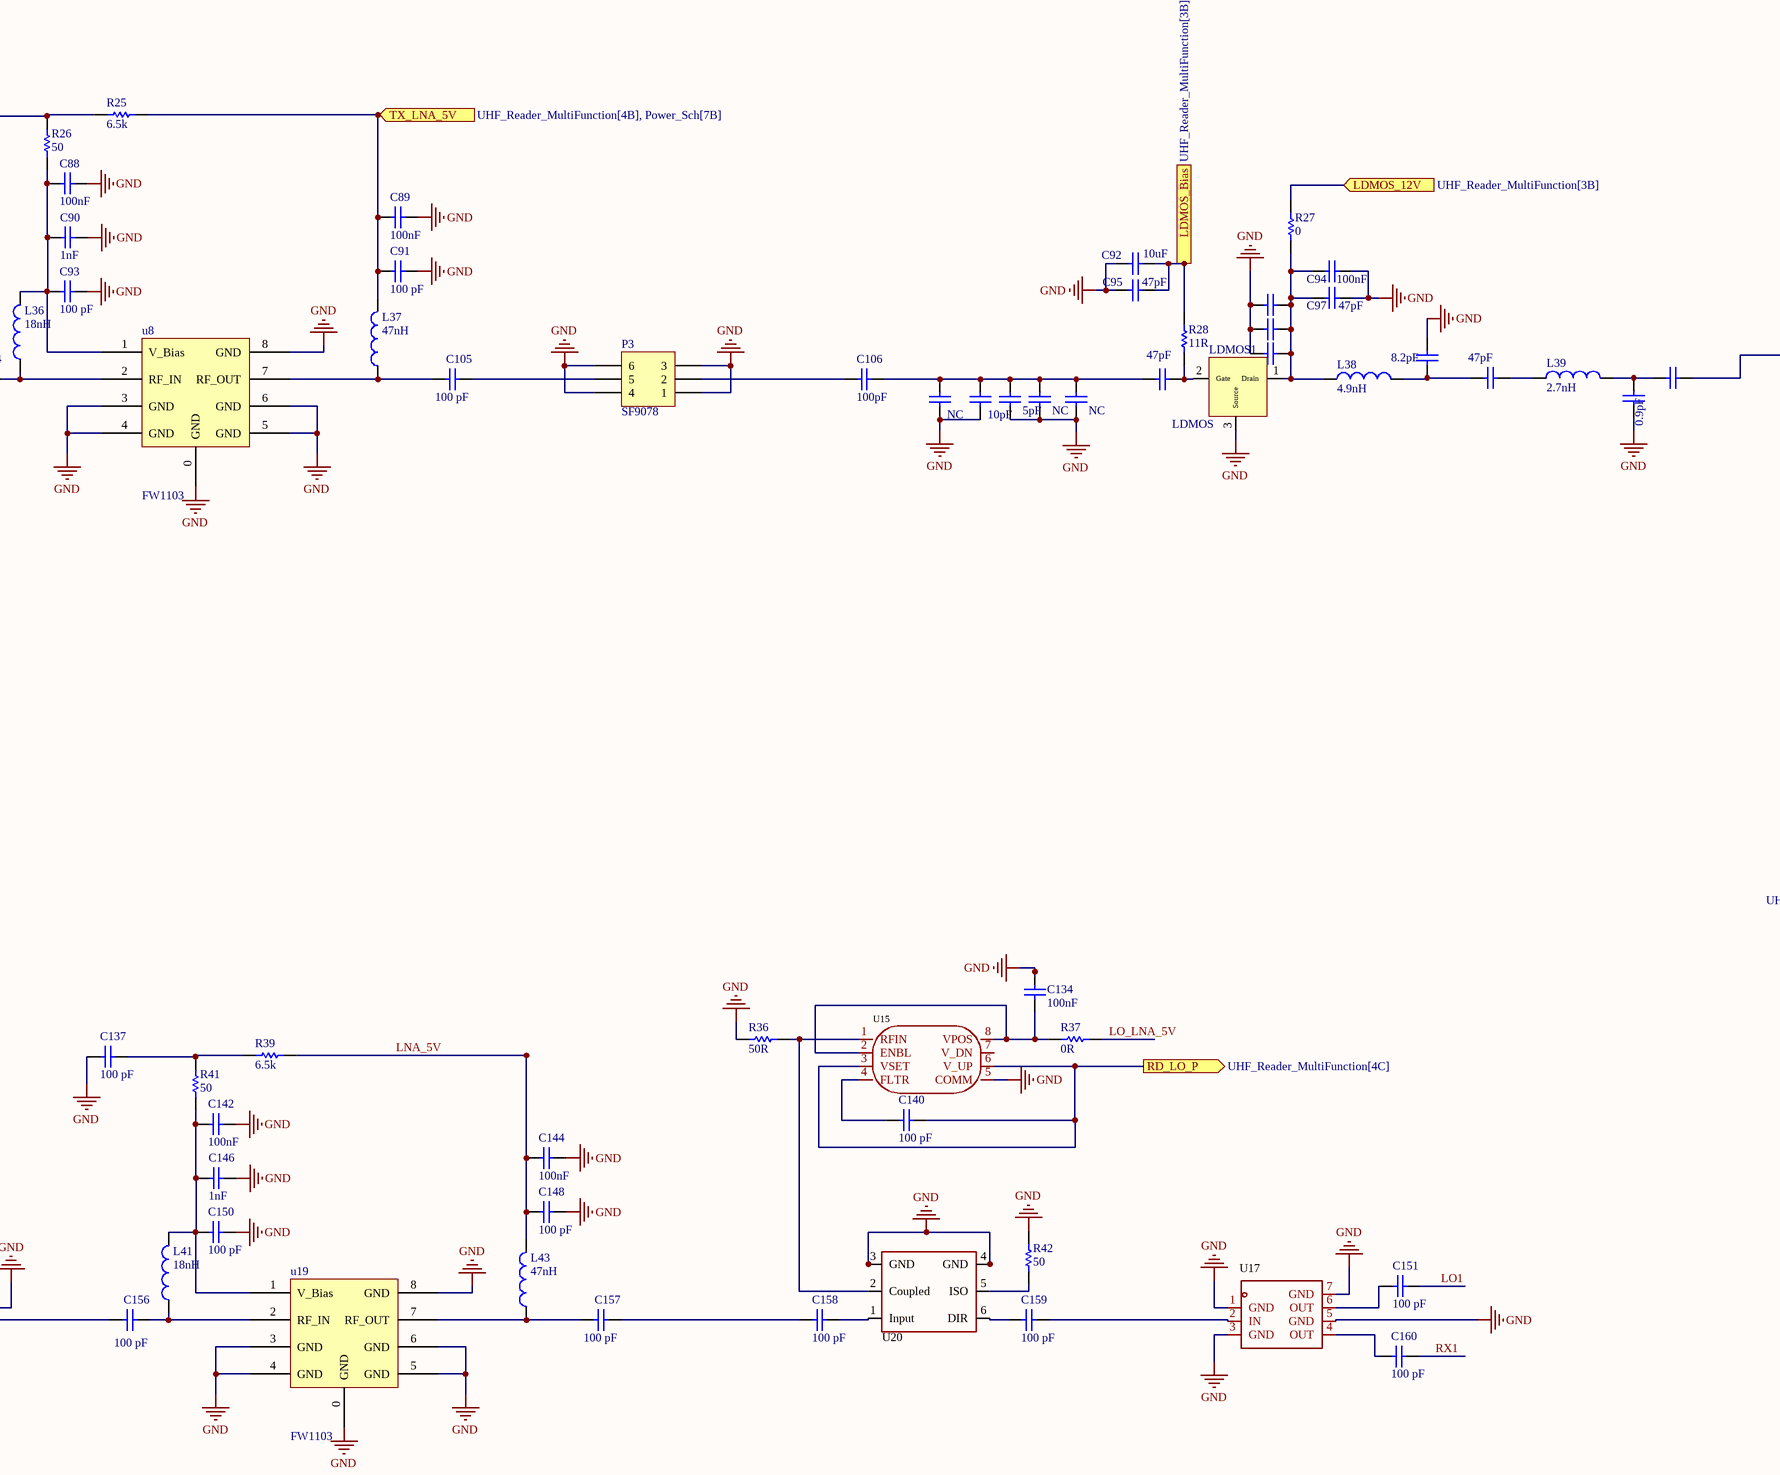
[diagram p4: RF_circuit.SchDoc, top middle]
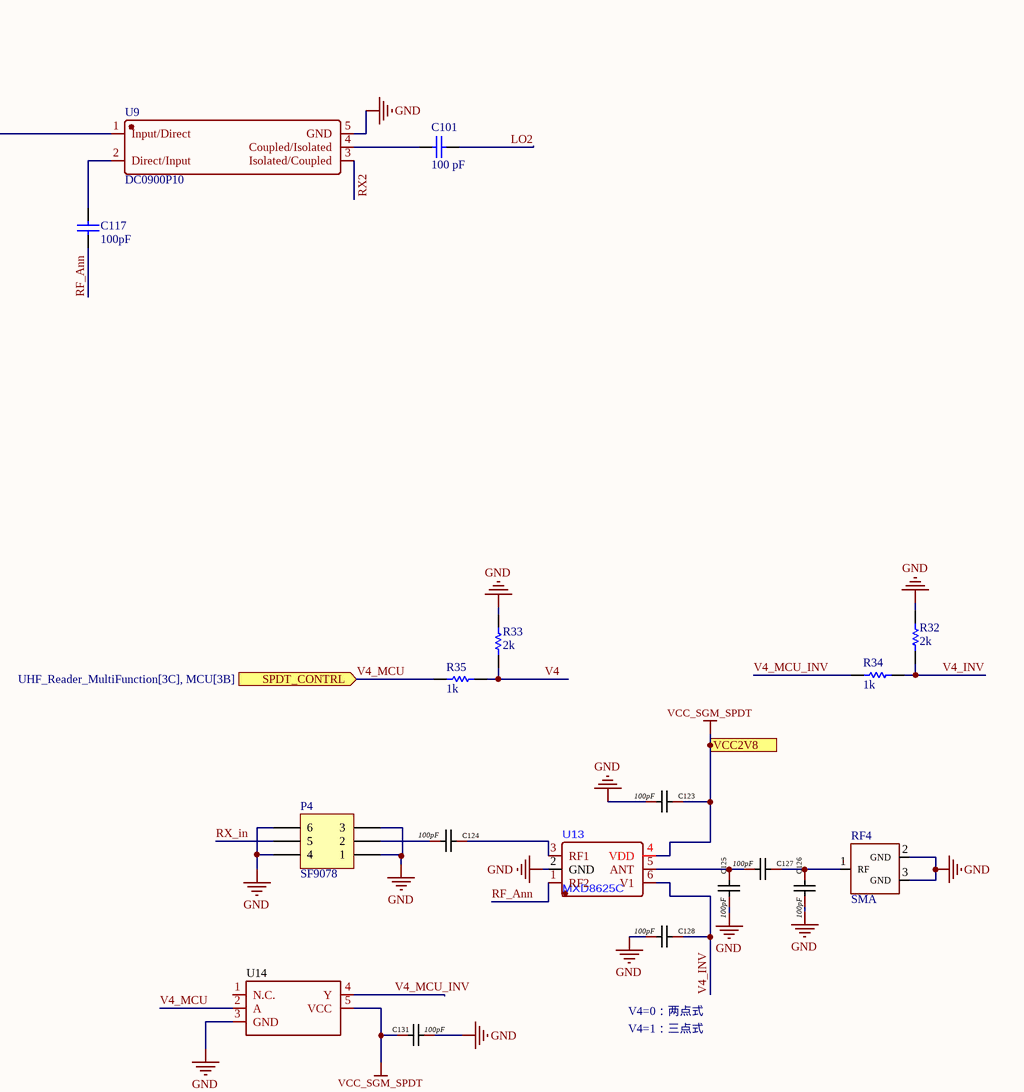
[diagram p5: RF_circuit.SchDoc, top right]
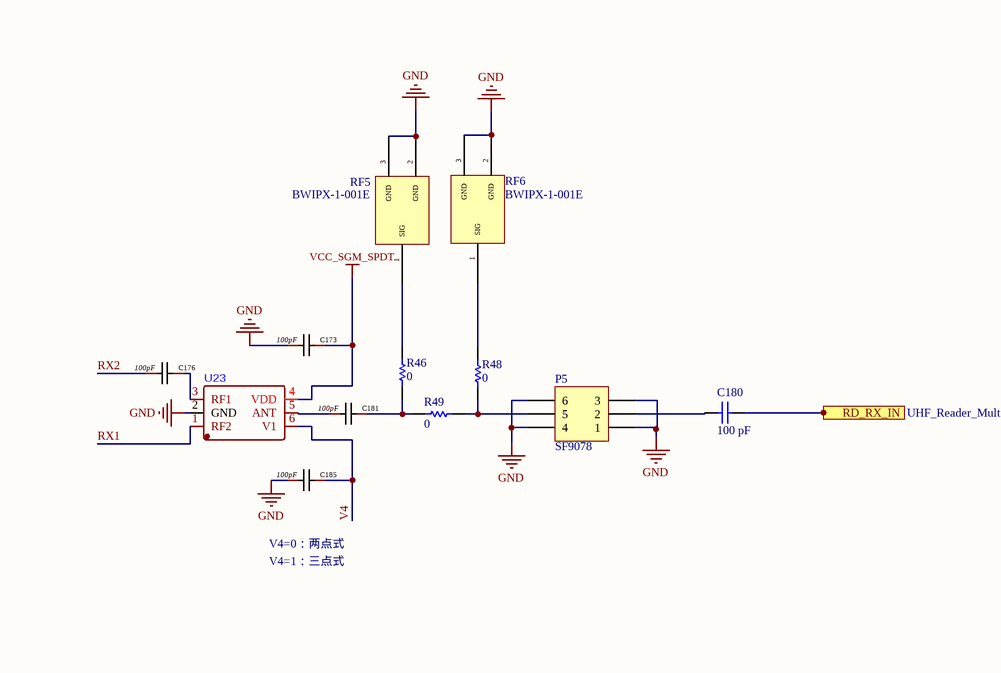
[diagram p6: RF_circuit.SchDoc, bottom left]
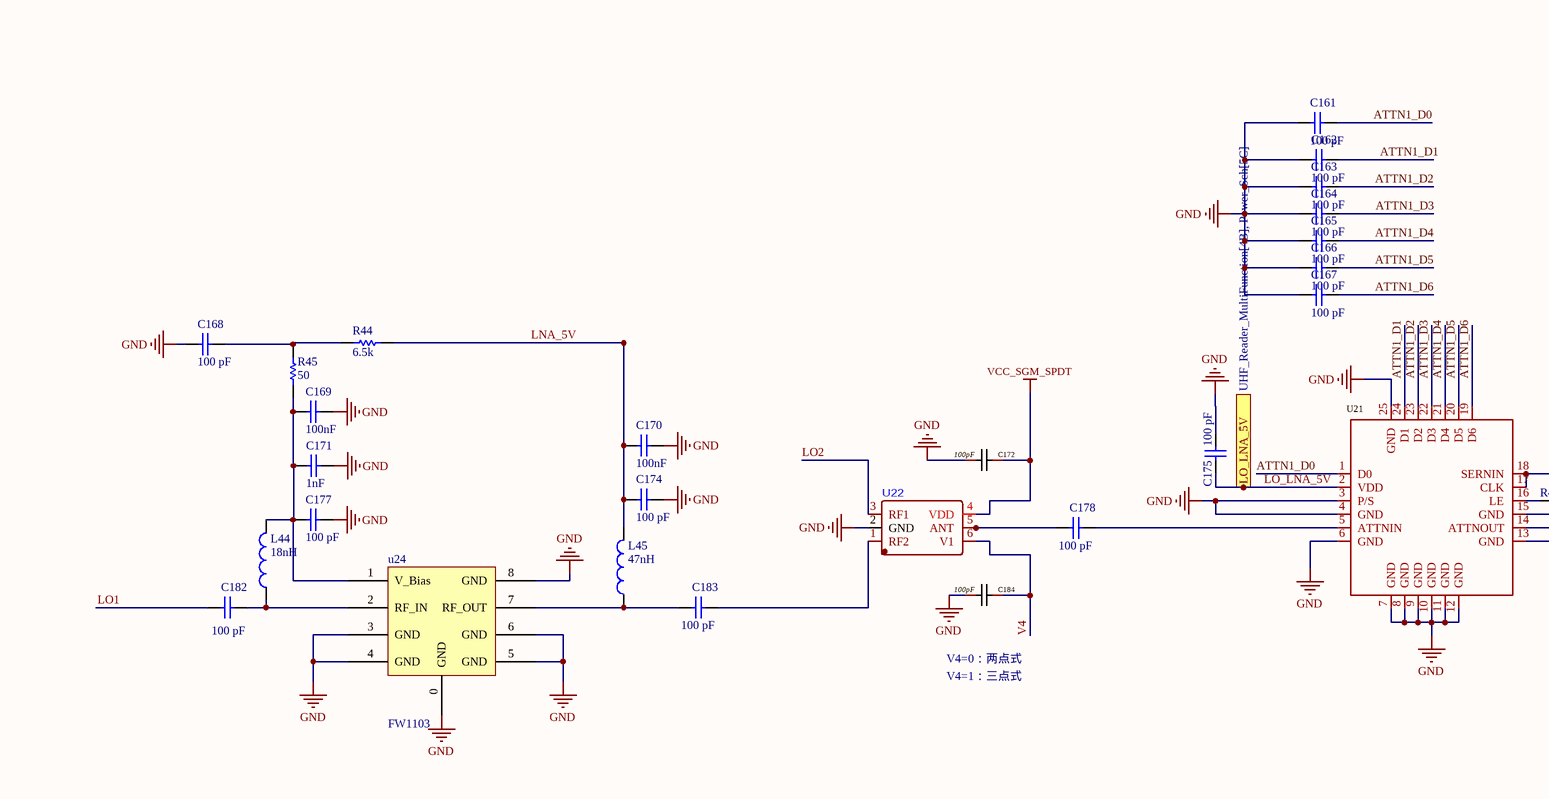
[diagram p7: RF_circuit.SchDoc, bottom middle]
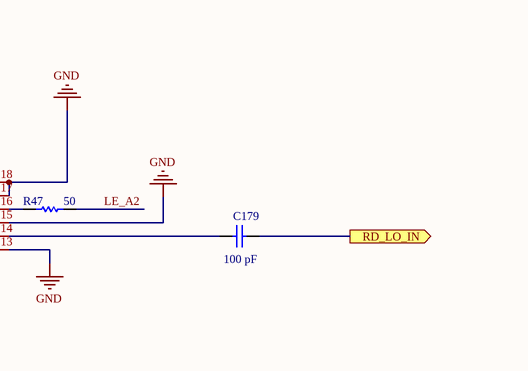
[diagram p8: RF_circuit.SchDoc, bottom right]

### Parts
C86  100 pF  [0402_Z]
C87  100 pF  [0402_Z]
C88  100nF  [0402_Z]
C89  100nF  [0402_Z]
C90  1nF  [0402_Z]
C91  100 pF  [0402_Z]
C92  10uF  [0805_Z]
C93  100 pF  [0402_Z]
C94  100nF  [1210_Z]
C95  47pF  [0603_Z]
C96  NC  [0603_Z]  (value not drawn)
C97  47pF  [0805_Z]
C98  NC  [0603_Z]  (value not drawn)
C99  NC  [0603_Z]  (value not drawn)
C100  8.2pF  [0402_Z]
C101  100 pF  [0402_Z]
C102  100 pF  [0402_Z]
C103  100 pF  [0402_Z]
C104  100 pF  [0402_Z]
C105  100 pF  [0402_Z]
C106  100pF  [0603_Z]
C107  47pF  [0402_Z]
C108  47pF  [0603_Z]
C109  100pF  [0603_Z]  (value not drawn)
C110  NC  [0402_Z]
C111  10pF  [0402_Z]
C112  0.9pF  [0402_Z]
C113  5pF  [0402_Z]
C114  NC  [0402_Z]
C115  NC  [0402_Z]
C116  100 pF  [0402_Z]
C117  100pF  [0402_Z]
C118  100 pF  [0402_Z]
C119  100 pF  [0402_Z]
C120  NC  [0402_Z]  (no BOM)
C121  NC  [0402_Z]  (no BOM)
C122  100 pF  [0402_Z]
C123  100pF  [0402_Z]
C124  100pF  [0402_Z]
C125  100pF  [0402_Z]
C126  100pF  [0402_Z]
C127  100pF  [0402_Z]
C128  100pF  [0402_Z]
C129  100 pF  [0402_Z]
C130  100 pF  [0402_Z]
C131  100pF  [0402_Z]
C132  100 pF  [0402_Z]
C133  100 pF  [0402_Z]
C134  100nF  [0402_Z]
C135  100 pF  [0402_Z]
C136  100 pF  [0402_Z]
C137  100 pF  [0402_Z]
C138  100 pF  [0402_Z]
C139  100 pF  [0402_Z]
C140  100 pF  [0402_Z]
C141  100nF  [0402_Z]
C142  100nF  [0402_Z]
C143  100nF  [0402_Z]
C144  100nF  [0402_Z]
C145  1nF  [0402_Z]
C146  1nF  [0402_Z]
C147  100 pF  [0402_Z]
C148  100 pF  [0402_Z]
C149  100 pF  [0402_Z]
C150  100 pF  [0402_Z]
C151  100 pF  [0402_Z]
C152  100 pF  [0402_Z]
C153  100 pF  [0402_Z]
C154  100 pF  [0402_Z]
C155  100 pF  [0402_Z]
C156  100 pF  [0402_Z]
C157  100 pF  [0402_Z]
C158  100 pF  [0402_Z]
C159  100 pF  [0402_Z]
C160  100 pF  [0402_Z]
C161  100 pF  [0402_Z]
C162  100 pF  [0402_Z]
C163  100 pF  [0402_Z]
C164  100 pF  [0402_Z]
C165  100 pF  [0402_Z]
C166  100 pF  [0402_Z]
C167  100 pF  [0402_Z]
C168  100 pF  [0402_Z]
C169  100nF  [0402_Z]
C170  100nF  [0402_Z]
C171  1nF  [0402_Z]
C172  100pF  [0402_Z]
C173  100pF  [0402_Z]
C174  100 pF  [0402_Z]
C175  100 pF  [0402_Z]
C176  100pF  [0402_Z]
C177  100 pF  [0402_Z]
C178  100 pF  [0402_Z]
C179  100 pF  [0402_Z]
C180  100 pF  [0402_Z]
C181  100pF  [0402_Z]
C182  100 pF  [0402_Z]
C183  100 pF  [0402_Z]
C184  100pF  [0402_Z]
C185  100pF  [0402_Z]
L36  18nH  [0402_Z]
L37  47nH  [0402_Z]
L38  4.9nH  [0603_Z]
L39  2.7nH  [0603_Z]
L40  18nH  [0402_Z]
L41  18nH  [0402_Z]
L42  47nH  [0402_Z]
L43  47nH  [0402_Z]
L44  18nH  [0402_Z]
L45  47nH  [0402_Z]
LDMOS1  LDMOS  [LDMOS]
P3  SF9078  [SF8009]
P4  SF9078  [SF8009]
P5  SF9078  [SF8009]
R23  2k  [0402_Z]
R24  1k  [0402_Z]
R25  6.5k  [0402_Z]
R26  50  [0402_Z]
R27  0  [0805]
R28  11R  [0603_Z]
R29  17R  [0402_Z]
R30  292R  [0402_Z]
R31  292R  [0402_Z]
R32  2k  [0402_Z]
R33  2k  [0402_Z]
R34  1k  [0402_Z]
R35  1k  [0402_Z]
R36  50R  [0402_Z]
R37  0R  [0402_Z]
R38  6.5k  [0402_Z]
R39  6.5k  [0402_Z]
R40  50  [0402_Z]
R41  50  [0402_Z]
R42  50  [0402_Z]
R43  50  [0402_Z]
R44  6.5k  [0402_Z]
R45  50  [0402_Z]
R46  0  [0402_Z]
R47  50  [0402_Z]
R48  0  [0402_Z]
R49  0  [0402_Z]
RF2  BWIPX-1-001E  [IPEX-SMD_BWIPX-1-001E]
RF3  BWIPX-1-001E  [IPEX-SMD_BWIPX-1-001E]
RF4  SMA  [SMAmini - duplicate]
RF5  BWIPX-1-001E  [IPEX-SMD_BWIPX-1-001E]
RF6  BWIPX-1-001E  [IPEX-SMD_BWIPX-1-001E]
u8  FW1103  [FW1103W]
U9  DC0900P10  [DC0900P10]
U10  MXD8625C  [MXD8625C]
U11  MXD8625C  [MXD8625C]
U12  AiP74LVC1G14GC.TR  [SOT-353 L2.1-W1.3-P0.65]  (value not drawn)
U13  MXD8625C  [BGA-6_L1.1-W0.7-R3-C2-P0.40-BR]
U14  AiP74LVC1G14GC.TR  [SOT-353_L2.1-W1.3-P0.65]  (value not drawn)
U15  MS2351  [MS2351]  (value not drawn)
U16  HGC2005LP4  [HGC2005LP4]  (value not drawn)
U17  PD0900U03-070  [PD0900U03-070]  (value not drawn)
u18  FW1103  [FW1103W]
u19  FW1103  [FW1103W]
U20  DC09T10  [DC09T10]  (value not drawn)
U21  HGC2005LP4  [HGC2005LP4]  (value not drawn)
U22  (no value)  [BGA-6_L1.1-W0.7-R3-C2-P0.40-BR]
U23  (no value)  [BGA-6_L1.1-W0.7-R3-C2-P0.40-BR]
u24  FW1103  [FW1103W]

### Ports
2.8V_DPDT (in, see UHF_Reader_MultiFunction[3B]), ATTN_Datal (harness ATTN1, see UHF_Reader_MultiFunction[4C], MCU_SLAVE[1B]), ATTN_LE (harness ATTN_LE, see UHF_Reader_MultiFunction[4C], MCU_SLAVE[2C]), EXTERNAL_VCTL (in, see UHF_Reader_MultiFunction[3C], MCU_SLAVE[3C]), LDMOS_12V (in, see UHF_Reader_MultiFunction[3B]), LDMOS_Bias (in, see UHF_Reader_MultiFunction[3B]), LO_LNA_5V (in, see UHF_Reader_MultiFunction[4B], Power_Sch[5C]), RD_LO_IN (out, see UHF_Reader_MultiFunction[3B], FMRD1616E[2A]), RD_LO_P (out, see UHF_Reader_MultiFunction[4C]), RD_RFOUT (in, see UHF_Reader_MultiFunction[3C], FMRD1616E[1C]), RD_RX_IN (out, see UHF_Reader_MultiFunction[3B], FMRD1616E[2A]), RX_LNA_5V (in, see UHF_Reader_MultiFunction[4B], Power_Sch[7B]), SPDT_CONTRL (in, see UHF_Reader_MultiFunction[3C], MCU[3B]), TX_LNA_5V (in, see UHF_Reader_MultiFunction[4B], Power_Sch[7B]), VCC2V8 (in, see UHF_Reader_MultiFunction[3B], Power_Sch[3D])

### Harnesses
ATTN1: D0, D1, D2, D3, D4, D5, D6
ATTN_LE: A1, A2

### Nets
GND: C86.1 C87.2 C88.1 C89.1 C90.1 C91.1 C92.1 C93.1 C94.2 C95.1 C96.1 C97.2 C98.1 C99.1 C100.1 C102.1 C103.1 C110.2 C111.2 C112.2 C113.1 C114.1 C115.1 C118.1 C119.1 C122.1 C123.2 C125.2 C126.2 C128.2 C129.2 C130.1 C131.2 C132.1 C133.1 C134.1 C135.2 C136.2 C137.2 C138.2 C139.2 C141.1 C142.1 C143.1 C144.1 C145.1 C146.1 C147.1 C148.1 C149.1 C150.1 C152.2 C161.2 C162.1 C163.1 C164.1 C165.2 C166.2 C167.2 C168.2 C169.1 C170.1 C171.1 C172.2 C173.2 C174.1 C175.2 C177.1 C184.2 C185.2 LDMOS1.3(Source) P3.1 P3.3 P3.4 P3.6 P4.1 P4.3 P4.4 P4.6 P5.1 P5.3 P5.4 P5.6 R23.1 R30.1 R31.1 R32.1 R33.1 R36.2 R42.1 RF2.2(GND) RF2.3(GND) RF3.2(GND) RF3.3(GND) RF4.2(GND) RF4.3(GND) RF5.2(GND) RF5.3(GND) RF6.2(GND) RF6.3(GND) u8.0(GND) u8.3(GND) u8.4(GND) u8.5(GND) u8.6(GND) u8.8(GND) U9.5(GND) U10.2(GND) U11.2(GND) U12.3(GND) U13.2(GND) U14.3(GND) U15.5(COMM) U16.3(P/S) U16.4(GND) U16.6(GND) U16.7(GND) U16.8(GND) U16.9(GND) U16.10(GND) U16.11(GND) U16.12(GND) U16.13(GND) U16.15(GND) U16.17(CLK) U16.18(SERNIN) U16.25(GND) U17.1(GND) U17.3(GND) U17.5(GND) U17.7(GND) u18.0(GND) u18.3(GND) u18.4(GND) u18.5(GND) u18.6(GND) u18.8(GND) u19.0(GND) u19.3(GND) u19.4(GND) u19.5(GND) u19.6(GND) u19.8(GND) U20.3(GND) U20.4(GND) U21.3(P/S) U21.4(GND) U21.6(GND) U21.7(GND) U21.8(GND) U21.9(GND) U21.10(GND) U21.11(GND) U21.12(GND) U21.13(GND) U21.15(GND) U21.17(CLK) U21.18(SERNIN) U21.25(GND) U22.2(GND) U23.2(GND) u24.0(GND) u24.3(GND) u24.4(GND) u24.5(GND) u24.6(GND) u24.8(GND)
VCC_SGM_SPDT: C123.1 C131.1 C172.1 C173.1 U13.4(VDD) U14.5(VCC) U22.4(VDD) U23.4(VDD) ; port VCC2V8
VDD_DPDT: C86.2 C103.2 C119.2 C122.2 U10.4(VDD) U11.4(VDD) U12.5(VCC) ; port 2.8V_DPDT
ADP_IN: R27.1 ; port LDMOS_12V
ATTN1_D0: C129.1 C161.1 U16.1(D0) U21.1(D0) ; port ATTN_Datal.D0
ATTN1_D1: C130.2 C162.2 U16.24(D1) U21.24(D1) ; port ATTN_Datal.D1
ATTN1_D2: C132.2 C163.2 U16.23(D2) U21.23(D2) ; port ATTN_Datal.D2
ATTN1_D3: C133.2 C164.2 U16.22(D3) U21.22(D3) ; port ATTN_Datal.D3
ATTN1_D4: C135.1 C165.1 U16.21(D4) U21.21(D4) ; port ATTN_Datal.D4
ATTN1_D5: C138.1 C166.1 U16.20(D5) U21.20(D5) ; port ATTN_Datal.D5
ATTN1_D6: C139.1 C167.1 U16.19(D6) U21.19(D6) ; port ATTN_Datal.D6
LE_A1: R43.2 ; port ATTN_LE.A1
LE_A2: R47.2 ; port ATTN_LE.A2
LNA_5V: C143.2 C144.2 C147.2 C148.2 C170.2 C174.2 L42.2 L43.2 L45.2 R38.2 R39.2 R44.2 ; port RX_LNA_5V
LO1: C151.1 C182.2
LO2: C101.2 U22.3(RF1)
LO_LNA_5V: C152.1 C175.1 R37.2 U16.2(VDD) U21.2(VDD) ; port LO_LNA_5V
PA0: C140.1 U15.3(VSET) U15.6(V_UP) ; port RD_LO_P
RF_Ann: C117.1 U13.1(RF2)
RX1: C160.1 U23.1(RF2)
RX2: C176.2 U9.3(Isolated/Coupled)
RX_in: C153.2 P4.5
V1_DPDT: C118.2 U11.6(V1) U12.4(Y)
V4: C184.1 C185.1 R33.2 R35.2 U22.6(V1) U23.6(V1)
V4_INV: C128.1 R32.2 R34.2 U13.6(V1)
V4_MCU: R35.1 U14.2(A) ; port SPDT_CONTRL
V4_MCU_INV: R34.1 U14.4(Y)
V_DPDT: C102.2 R23.2 R24.2 U10.6(V1) U12.2(A)
NetC87_1: C87.1 R25.1 R26.1
NetC88_2: C88.2 C90.2 C93.2 L36.2 R26.2 u8.1(V_Bias)
NetC89_2: C89.2 C91.2 L37.2 R25.2 ; port TX_LNA_5V
NetC92_2: C92.2 C95.2 R28.2 ; port LDMOS_Bias
NetC94_1: C94.1 C96.2 C97.1 C98.2 C99.2 L38.1 LDMOS1.1(Drain) R27.2
NetC100_2: C100.2 C108.1 L38.2
NetC101_1: C101.1 U9.4(Coupled/Isolated)
NetC104_1: C104.1 L36.1 u8.2(RF_IN)
NetC104_2: C104.2 U11.5(ANT)
NetC105_1: C105.1 P3.5
NetC105_2: C105.2 L37.1 u8.7(RF_OUT)
NetC106_1: C106.1 P3.2
NetC106_2: C106.2 C107.1 C110.1 C111.1 C113.2 C114.2 C115.2
NetC107_2: C107.2 LDMOS1.2(Gate) R28.1
NetC108_2: C108.2 L39.1
NetC109_1: C109.1 C112.1 L39.2
NetC109_2: C109.2 U9.1(Input/Direct)
NetC116_1: C116.1 U10.5(ANT)
NetC116_2: C116.2 R29.2 R31.2
NetC117_2: C117.2 U9.2(Direct/Input)
NetC120_1: C120.1 RF2.1(SIG)
NetC120_2: C120.2 U10.3(RF1)
NetC121_1: C121.1 RF3.1(SIG)
NetC121_2: C121.2 U11.1(RF2)
NetC124_1: C124.1 U13.3(RF1)
NetC124_2: C124.2 P4.2
NetC125_1: C125.1 C127.2 U13.5(ANT)
NetC126_1: C126.1 C127.1 RF4.1(RF)
NetC134_2: C134.2 R37.1 U15.2(ENBL) U15.8(VPOS)
NetC136_1: C136.1 R38.1 R40.1
NetC137_1: C137.1 R39.1 R41.1
NetC140_2: C140.2 U15.4(FLTR)
NetC141_2: C141.2 C145.2 C149.2 L40.2 R40.2 u18.1(V_Bias)
NetC142_2: C142.2 C146.2 C150.2 L41.2 R41.2 u19.1(V_Bias)
NetC151_2: C151.2 U17.6(OUT)
NetC153_1: C153.1 L40.1 u18.2(RF_IN)
NetC154_1: C154.1 C155.2
NetC154_2: C154.2 L42.1 u18.7(RF_OUT)
NetC155_1: C155.1 U16.5(ATTNIN)
NetC156_1: C156.1 L41.1 u19.2(RF_IN)
NetC156_2: C156.2 U16.14(ATTNOUT)
NetC157_1: C157.1 C158.2
NetC157_2: C157.2 L43.1 u19.7(RF_OUT)
NetC158_1: C158.1 U20.1(Input)
NetC159_1: C159.1 U17.2(IN)
NetC159_2: C159.2 U20.6(DIR)
NetC160_2: C160.2 U17.4(OUT)
NetC168_1: C168.1 R44.1 R45.1
NetC169_2: C169.2 C171.2 C177.2 L44.2 R45.2 u24.1(V_Bias)
NetC176_1: C176.1 U23.3(RF1)
NetC178_1: C178.1 U21.5(ATTNIN)
NetC178_2: C178.2 U22.5(ANT)
NetC179_1: C179.1 ; port RD_LO_IN
NetC179_2: C179.2 U21.14(ATTNOUT)
NetC180_1: C180.1 ; port RD_RX_IN
NetC180_2: C180.2 P5.2
NetC181_1: C181.1 R46.1 R49.2
NetC181_2: C181.2 U23.5(ANT)
NetC182_1: C182.1 L44.1 u24.2(RF_IN)
NetC183_1: C183.1 U22.1(RF2)
NetC183_2: C183.2 L45.1 u24.7(RF_OUT)
NetP5_5: P5.5 R48.1 R49.1
NetR24_1: R24.1 ; port EXTERNAL_VCTL
NetR29_1: R29.1 R30.2 ; port RD_RFOUT
NetR36_1: R36.1 U15.1(RFIN) U20.2(Coupled)
NetR42_2: R42.2 U20.5(ISO)
NetR43_1: R43.1 U16.16(LE)
NetR46_2: R46.2 RF5.1(SIG)
NetR47_1: R47.1 U21.16(LE)
NetR48_2: R48.2 RF6.1(SIG)
NetU10_1: U10.1(RF2) U11.3(RF1)

Not connected (* = marked no-connect by the designer): U12 1(N.C.); U14 1(N.C.); U15 7(V_DN)

### Notes on the sheet
- (near R23) V_DPDT=0,本地直连V_DPDT=1,外置移相器
- V4=0：两点式
- V4=1：三点式

### Library data of the parts
C86-C105 C107 C108 C110-C116 C118 C119 C122 C129 C130 C132-C171 C174 C175 C177-C180 C182 C183 = Cap: Capacitor; Value: 100pF; Published: 8-Jun-2000; LatestRevisionDate: 17-Jul-2002; LatestRevisionNote: Re-released for DXP Platform.; PackageReference: RAD-0.3; Publisher: Altium Limited; PackageDescription: Radial Cap, Thru-Hole; 2 Leads; 0.3 in Pin Spacing
C106 C109 C117 = Cap: Capacitor; Published: 8-Jun-2000; LatestRevisionDate: 17-Jul-2002; LatestRevisionNote: Re-released for DXP Platform.; PackageReference: RAD-0.3; Publisher: Altium Limited; PackageDescription: Radial Cap, Thru-Hole; 2 Leads; 0.3 in Pin Spacing; Value: 100pF
C120 C121 = Cap_NC
C123-C128 C131 C172 C173 C176 C181 C184 C185 = Cap
L36-L45 = Inductor: Code_IEC: 1005; Value: 10mH; Published: 8-Jun-2000; LatestRevisionDate: 29-May-2009; LatestRevisionNote: IPC-7351 Footprint Added.; PackageReference: 0402-A; Publisher: Altium Limited; PackageDescription: Chip Inductor; Code_JEITA: 0402
P3-P5 = Header 3X2A: Header, 3-Pin, Dual row; LatestRevisionDate: 17-Jul-2002; LatestRevisionNote: Re-released for DXP Platform.; Publisher: Altium Limited
R23 R24 R32-R35 = Resistor: Thick Film Resistor
  R23 R32 R33: Value: 2k
  R24 R34 R35: Value: 1k
R25-R31 R36-R49 = Res1: Resistor; Value: 1K; Published: 8-Jun-2000; LatestRevisionDate: 17-Jul-2002; LatestRevisionNote: Re-released for DXP Platform.; PackageReference: AXIAL-0.3; Publisher: Altium Limited; PackageDescription: Axial Device, Thru-Hole; 2 Leads; 0.3 in Pin Spacing
U9 = DC0900A10
U12 U14 = 反相器: Manufacturer_Name: Wuxi I-CORE Electronics Co.; Datasheet Link: https://datasheet.lcsc.com/lcsc/2208161803_Wuxi-I-core-Elec-AiP74LVC1G14GC-TR_C5138995.pdf; Height: 1.1mm; Manufacturer_Part_Number: AiP74LVC1G14GC
U15 = MS2351: 功率检测器; Manufacturer: 杭州瑞盟; Add into BOM: yes; Name: MS2351; Symbol: MS2351; Device: MS2351; LCSC Part Name: MS2351; Supplier Part: C1509084; Manufacturer Part: MS2351; Supplier Footprint: MSOP-8; JLCPCB Part Class: Extended Part; Datasheet: https://atta.szlcsc.com/upload/public/pdf/source/20201221/C1509084_D980DDA325D6CD8A9ADBC0470C8A29D7.pdf; Supplier: LCSC; Convert to PCB: yes; Amplifier Type: -; Number of Circuits: -; -3db Bandwidth（G=1）: -; Current - Input Bias（Ib）: -; Voltage - Input Offset（Vos）: -; Gain Bandwidth Product（GBP）: -; Slew Rate（SR）: -; Output Type: -; Supply Voltage（Single）: -; Iq per channel (Typ): -; Operating Temperature: -
U16 U21 = HGC2005LP4: 数控衰减器
U17 = 功分器_研通: 工作频率 800-1000 MHz
U22 U23 = MXD8625C

## Sheet MCU.SchDoc
size A3; SheetNumber: 2; SheetTotal: 6
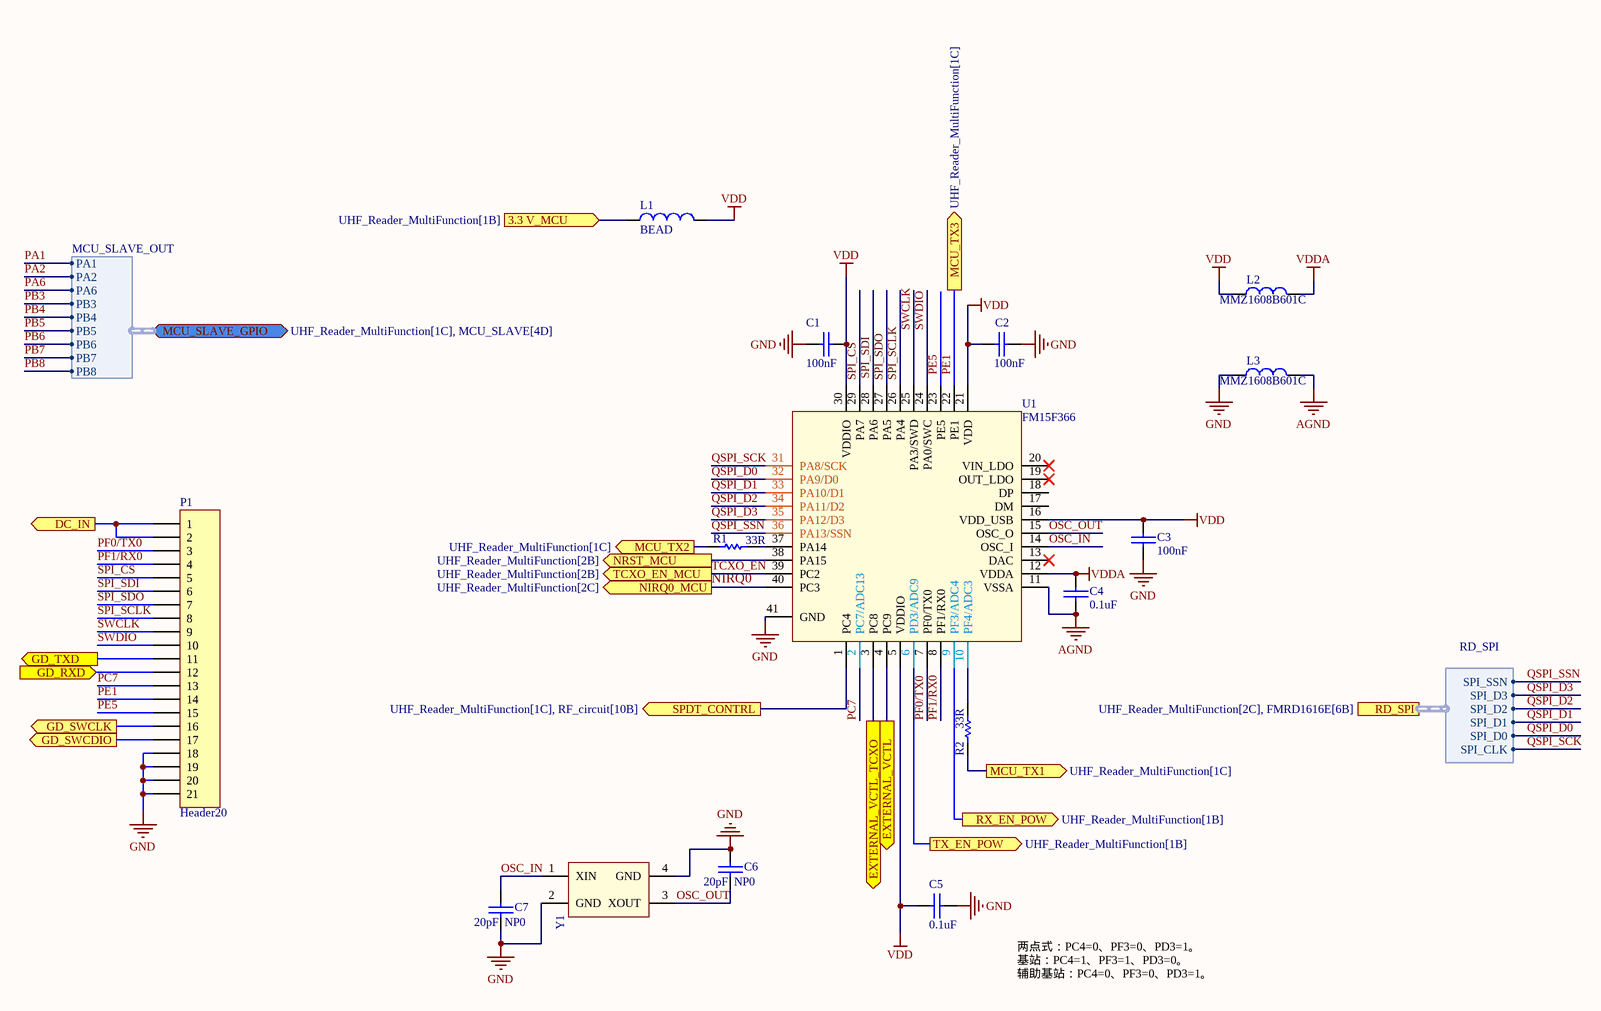
[diagram p9: MCU.SchDoc]

### Parts
C1  100nF  [0402_Z]
C2  100nF  [0402_Z]
C3  100nF  [0402_Z]
C4  0.1uF  [0402_Z]
C5  0.1uF  [0402_Z]
C6  20pF  NP0  [0402_Z]
C7  20pF  NP0  [0402_Z]
L1  BEAD  [0603_Z]
L2  MMZ1608B601C  [0402_Z]
L3  MMZ1608B601C  [0402_Z]
P1  Header20  [Header20]
R1  33R  [0402_Z]
R2  33R  [0402_Z]
U1  FM15F366  [QFN40 5X5X04P]
Y1  12MHz无源晶振  [XTAL_2520]  (value not drawn)

### Ports
3.3 V_MCU (in, see UHF_Reader_MultiFunction[1B]), DC_IN (out, see UHF_Reader_MultiFunction[1B], Power_Sch[4A]), EXTERNAL_VCTL (out), EXTERNAL_VCTL_TCXO (out), GD_RXD (in), GD_SWCDIO (out, see UHF_Reader_MultiFunction[1C]), GD_SWCLK (out, see UHF_Reader_MultiFunction[1C], MCU_SLAVE[3C]), GD_TXD (out), MCU_SLAVE_GPIO (bidir, harness MCU_SLAVE_OUT, see UHF_Reader_MultiFunction[1C], MCU_SLAVE[4D]), MCU_TX1 (out, see UHF_Reader_MultiFunction[1C]), MCU_TX2 (out, see UHF_Reader_MultiFunction[1C]), MCU_TX3 (out, see UHF_Reader_MultiFunction[1C]), NIRQ0_MCU (out, see UHF_Reader_MultiFunction[2C]), NRST_MCU (out, see UHF_Reader_MultiFunction[2B]), RD_SPI (harness RD_SPI, see UHF_Reader_MultiFunction[2C], FMRD1616E[6B]), RX_EN_POW (out, see UHF_Reader_MultiFunction[1B]), SPDT_CONTRL (out, see UHF_Reader_MultiFunction[1C], RF_circuit[10B]), TCXO_EN_MCU (out, see UHF_Reader_MultiFunction[2B]), TX_EN_POW (out, see UHF_Reader_MultiFunction[1B])

### Harnesses
RD_SPI: SPI_CLK, SPI_D0, SPI_D1, SPI_D2, SPI_D3, SPI_SSN
MCU_SLAVE_OUT: PA1, PA2, PA6, PB3, PB4, PB5, PB6, PB7, PB8

### Nets
AGND: C4.2 L3.2 U1.11(VSSA)
GND: C1.2 C2.2 C3.1 C5.2 C6.2 C7.1 L3.1 P1.18 P1.19 P1.20 P1.21 U1.41(GND) Y1.2(GND) Y1.4(GND)
MCU_3V3: L1.1 ; port 3.3 V_MCU
VDD: C1.1 C2.1 C3.2 C5.1 L1.2 L2.1 U1.5(VDDIO) U1.16(VDD_USB) U1.21(VDD) U1.30(VDDIO)
VDDA: C4.1 L2.2 U1.12(VDDA)
NIRQ0: U1.40(PC3) ; port NIRQ0_MCU
OSC_IN: C7.2 U1.14(OSC_I) Y1.1(XIN)
OSC_OUT: C6.1 U1.15(OSC_O) Y1.3(XOUT)
PA3: R2.1 ; port MCU_TX1
PA4: R1.2 ; port MCU_TX2
PA13: P1.17 ; port GD_SWCDIO
PA14: P1.16 ; port GD_SWCLK
PB3: port MCU_SLAVE_GPIO.PB3, port MCU_SLAVE_GPIO.PB6  [also labelled PB6]
PB6: P1.11 ; port GD_TXD
PB7: P1.12 ; port GD_RXD
PC7: P1.13 U1.2(PC7/ADC13)
PE1: P1.14 U1.22(PE1) ; port MCU_TX3
PE5: P1.15 U1.23(PE5)
PF0/TX0: P1.3 U1.7(PF0/TX0)
PF1/RX0: P1.4 U1.8(PF1/RX0)
QSPI_D0: U1.32(PA9/D0) ; port RD_SPI.SPI_D0
QSPI_D1: U1.33(PA10/D1) ; port RD_SPI.SPI_D1
QSPI_D2: U1.34(PA11/D2) ; port RD_SPI.SPI_D2
QSPI_D3: U1.35(PA12/D3) ; port RD_SPI.SPI_D3
QSPI_SCK: U1.31(PA8/SCK) ; port RD_SPI.SPI_CLK
QSPI_SSN: U1.36(PA13/SSN) ; port RD_SPI.SPI_SSN
SPI_CS: P1.5 U1.29(PA7)
SPI_SCLK: P1.8 U1.26(PA4)
SPI_SDI: P1.6 U1.28(PA6)
SPI_SDO: P1.7 U1.27(PA5)
SWCLK: P1.9 U1.25(PA3/SWD)
SWDIO: P1.10 U1.24(PA0/SWC)
TCXO_EN: U1.39(PC2) ; port TCXO_EN_MCU
TX_EN: U1.6(PD3/ADC9) ; port TX_EN_POW
V4_MCU: U1.1(PC4) ; port SPDT_CONTRL
NetF1_1: P1.1 P1.2 ; port DC_IN
NetR1_1: R1.1 U1.37(PA14)
NetR2_2: R2.2 U1.10(PF4/ADC3)
NetR11_1: U1.38(PA15) ; port NRST_MCU
NetR22_1: U1.4(PC9) ; port EXTERNAL_VCTL
NetR24_1: U1.3(PC8) ; port EXTERNAL_VCTL_TCXO
NetU1_9: U1.9(PF3/ADC4) ; port RX_EN_POW

Not connected (* = marked no-connect by the designer): U1 13(DAC)* 17(DM) 18(DP) 19(OUT_LDO)* 20(VIN_LDO)*

### Notes on the sheet
- 两点式：PC4=0、PF3=0、PD3=1。
  基站：PC4=1、PF3=1、PD3=0。
  辅助基站：PC4=0、PF3=0、PD3=1。

### Library data of the parts
C1-C3 = CAP: 0402; Value: 0.1uF
C4-C7 = CAP: 0402
  C4 C5: Value: 0.1uF
  C6 C7: Value: 20pF  NP0
L1 = Inductor: Code_IEC: 1005; Value: 10mH; Published: 8-Jun-2000; LatestRevisionDate: 29-May-2009; LatestRevisionNote: IPC-7351 Footprint Added.; PackageReference: 0402-A; Publisher: Altium Limited; PackageDescription: Chip Inductor; Code_JEITA: 0402
L2 L3 = INDUCTOR1: INDUCTOR; Value: ?nH
R1 R2 = Res: 0402; Value: 100R; Published: 8-Jun-2000; Revision: July-2002: Re-released for DXP Platform.; Publisher: Altium Limited
U1 = FM399_QFN40
Y1 = XTAL 3225: PCB DECAL: 3225; Source_Path: E:\LI LELE\DESIGN KIT\DESIGN KIT_ESP8089_DEMO\ESP8089_DEMO.DSN

## Sheet Power_Sch.SchDoc
size A3; SheetNumber: 5; SheetTotal: 6
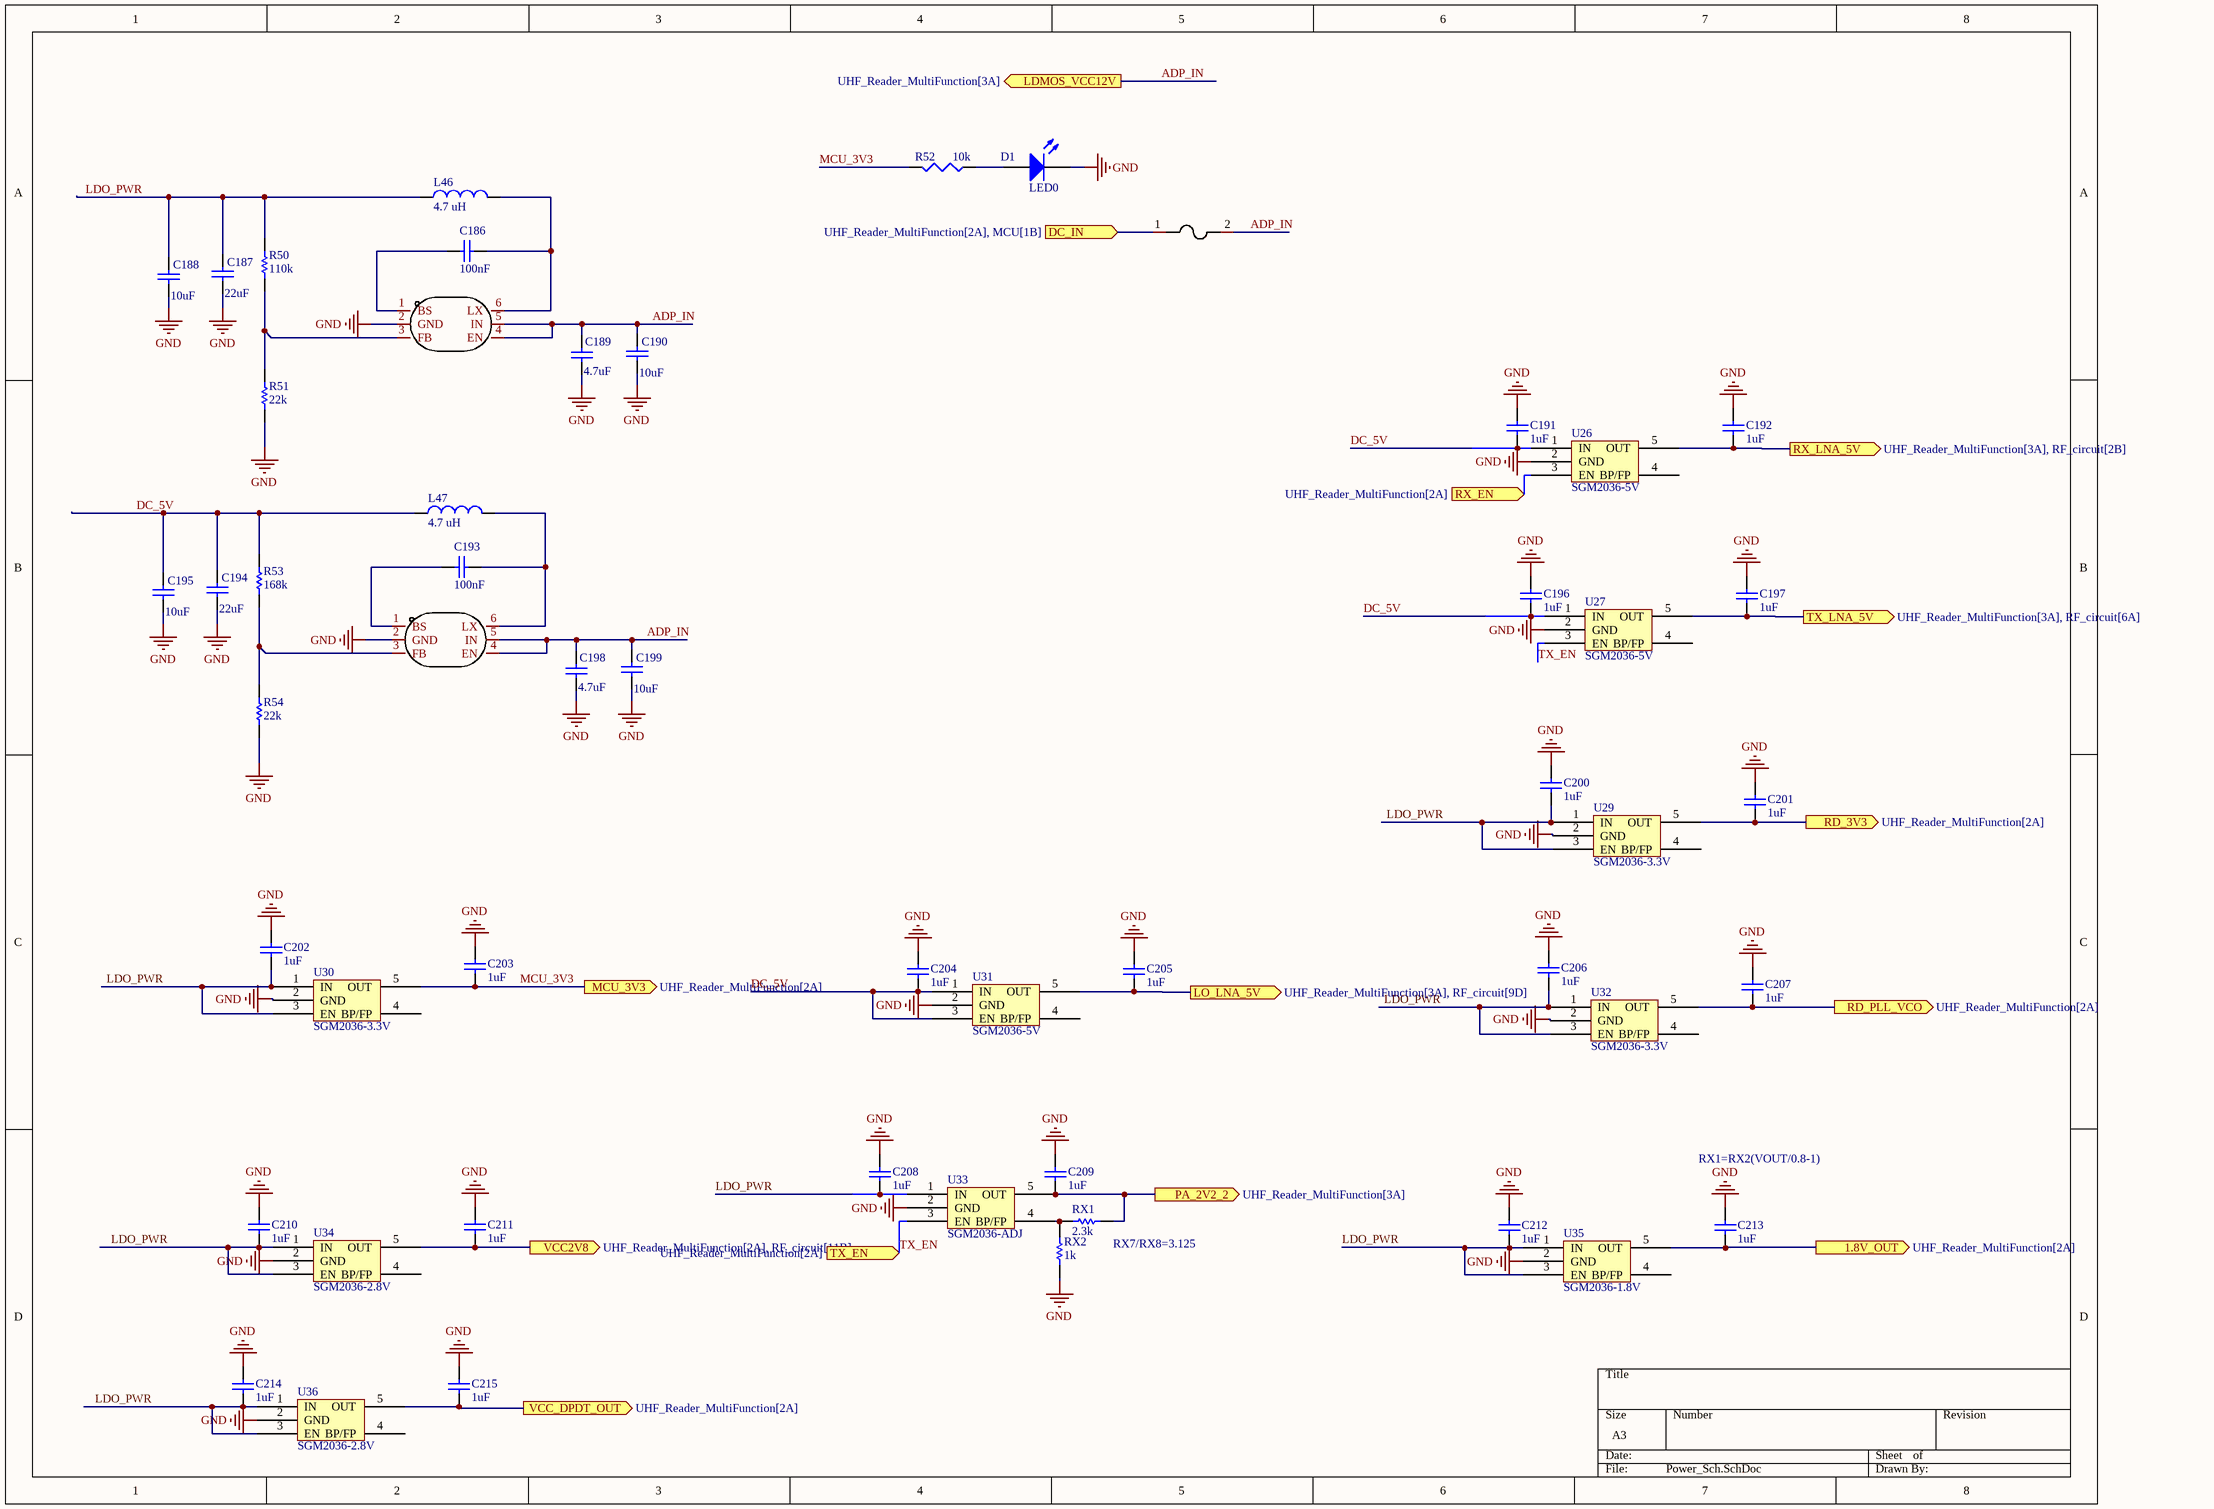
[diagram p10: Power_Sch.SchDoc]

### Parts
C186  100nF  [0402_Z]
C187  22uF  [0805_Z]
C188  10uF  [0805_Z]
C189  4.7uF  [0805_Z]
C190  10uF  [0805_Z]
C191  1uF  [0603_Z]
C192  1uF  [0603_Z]
C193  100nF  [0402_Z]
C194  22uF  [0805_Z]
C195  10uF  [0805_Z]
C196  1uF  [0603_Z]
C197  1uF  [0603_Z]
C198  4.7uF  [0805_Z]
C199  10uF  [0805_Z]
C200  1uF  [0603_Z]
C201  1uF  [0603_Z]
C202  1uF  [0603_Z]
C203  1uF  [0603_Z]
C204  1uF  [0603_Z]
C205  1uF  [0603_Z]
C206  1uF  [0603_Z]
C207  1uF  [0603_Z]
C208  1uF  [0603_Z]
C209  1uF  [0603_Z]
C210  1uF  [0603_Z]
C211  1uF  [0603_Z]
C212  1uF  [0603_Z]
C213  1uF  [0603_Z]
C214  1uF  [0603_Z]
C215  1uF  [0603_Z]
D1  LED0  [0603_Z]
F1  JFC1206-1300FS  [F1206]  (value not drawn)
L46  4.7 uH  [INDC 4040X25N]
L47  4.7 uH  [INDC 4040X25N]
R50  110k  [0603_Z]
R51  22k  [0603_Z]
R52  10k  [0402_Z]
R53  168k  [0603_Z]
R54  22k  [0603_Z]
RX1  2.3k  [0402_Z]
RX2  1k  [0402_Z]
U25  SY8121BABC  [SOT-23-6_L2.9-W1.6-P0.95-LS2.8-TL]  (value not drawn)
U26  SGM2036-5V  [SOT-23-5]
U27  SGM2036-5V  [SOT-23-5]
U28  SY8121BABC  [SOT-23-6_L2.9-W1.6-P0.95-LS2.8-TL]  (value not drawn)
U29  SGM2036-3.3V  [SOT-23-5]
U30  SGM2036-3.3V  [SOT-23-5]
U31  SGM2036-5V  [SOT-23-5]
U32  SGM2036-3.3V  [SOT-23-5]
U33  SGM2036-ADJ  [SOT-23-5]
U34  SGM2036-2.8V  [SOT-23-5]
U35  SGM2036-1.8V  [SOT-23-5]
U36  SGM2036-2.8V  [SOT-23-5]

### Ports
1.8V_OUT (out, see UHF_Reader_MultiFunction[2A]), DC_IN (in, see UHF_Reader_MultiFunction[2A], MCU[1B]), LDMOS_VCC12V (out, see UHF_Reader_MultiFunction[3A]), LO_LNA_5V (out, see UHF_Reader_MultiFunction[3A], RF_circuit[9D]), MCU_3V3 (out, see UHF_Reader_MultiFunction[2A]), PA_2V2_2 (out, see UHF_Reader_MultiFunction[3A]), RD_3V3 (out, see UHF_Reader_MultiFunction[2A]), RD_PLL_VCO (out, see UHF_Reader_MultiFunction[2A]), RX_EN (in, see UHF_Reader_MultiFunction[2A]), RX_LNA_5V (out, see UHF_Reader_MultiFunction[3A], RF_circuit[2B]), TX_EN (in, see UHF_Reader_MultiFunction[2A]), TX_LNA_5V (out, see UHF_Reader_MultiFunction[3A], RF_circuit[6A]), VCC2V8 (out, see UHF_Reader_MultiFunction[2A], RF_circuit[11B]), VCC_DPDT_OUT (out, see UHF_Reader_MultiFunction[2A])

### Nets
GND: C187.2 C188.2 C189.2 C190.2 C191.2 C192.2 C194.2 C195.2 C196.2 C197.2 C198.2 C199.2 C200.2 C201.2 C202.2 C203.2 C204.2 C205.2 C206.2 C207.2 C208.2 C209.2 C210.2 C211.2 C212.2 C213.2 C214.2 C215.2 D1.2(K) R51.1 R54.1 RX2.2 U25.2(GND) U26.2(GND) U27.2(GND) U28.2(GND) U29.2(GND) U30.2(GND) U31.2(GND) U32.2(GND) U33.2(GND) U34.2(GND) U35.2(GND) U36.2(GND)
MCU_3V3: C203.1 R52.2 U30.5(OUT) ; port MCU_3V3
VCC_+1.8 V: C213.1 U35.5(OUT) ; port 1.8V_OUT
VCC_+3.3 V: C201.1 U29.5(OUT) ; port RD_3V3
VCC_SGM_SPDT: C211.1 U34.5(OUT) ; port VCC2V8
VDD_DPDT: C215.1 U36.5(OUT) ; port VCC_DPDT_OUT
ADP_IN: C189.1 C190.1 C198.1 C199.1 F1.2 U25.4(EN) U25.5(IN) U28.4(EN) U28.5(IN) ; port LDMOS_VCC12V
DC_5V: C191.1 C194.1 C195.1 C196.1 C204.1 L47.1 R53.2 U26.1(IN) U27.1(IN) U31.1(IN) U31.3(EN)
LDO_PWR: C187.1 C188.1 C200.1 C202.1 C206.1 C208.1 C210.1 C212.1 C214.1 L46.1 R50.2 U29.1(IN) U29.3(EN) U30.1(IN) U30.3(EN) U32.1(IN) U32.3(EN) U33.1(IN) U34.1(IN) U34.3(EN) U35.1(IN) U35.3(EN) U36.1(IN) U36.3(EN)
LNA_5V: C192.1 U26.5(OUT) ; port RX_LNA_5V
LO_LNA_5V: C205.1 U31.5(OUT) ; port LO_LNA_5V
TX_EN: U27.3(EN) U33.3(EN) ; port TX_EN
NetC89_2: C197.1 U27.5(OUT) ; port TX_LNA_5V
NetC92_2: C209.1 RX1.2 U33.5(OUT) ; port PA_2V2_2
NetC186_1: C186.1 L46.2 U25.6(LX)
NetC186_2: C186.2 U25.1(BS)
NetC193_1: C193.1 L47.2 U28.6(LX)
NetC193_2: C193.2 U28.1(BS)
NetC207_1: C207.1 U32.5(OUT) ; port RD_PLL_VCO
NetD1_1: D1.1(A) R52.1
NetF1_1: F1.1 ; port DC_IN
NetR50_1: R50.1 R51.2 U25.3(FB)
NetR53_1: R53.1 R54.2 U28.3(FB)
NetRX1_1: RX1.1 RX2.1 U33.4(BP/FP)
NetU1_9: U26.3(EN) ; port RX_EN

Not connected (* = marked no-connect by the designer): U26 4(BP/FP); U27 4(BP/FP); U29 4(BP/FP); U30 4(BP/FP); U31 4(BP/FP); U32 4(BP/FP); U34 4(BP/FP); U35 4(BP/FP); U36 4(BP/FP)

### Notes on the sheet
- RX1=RX2(VOUT/0.8-1)
- (near RX1) RX7/RX8=3.125

### Library data of the parts
C186-C215 = Cap: Capacitor; Value: 100pF; Published: 8-Jun-2000; LatestRevisionDate: 17-Jul-2002; LatestRevisionNote: Re-released for DXP Platform.; PackageReference: RAD-0.3; Publisher: Altium Limited; PackageDescription: Radial Cap, Thru-Hole; 2 Leads; 0.3 in Pin Spacing
D1 = LED0: Typical INFRARED GaAs LED; Published: 8-Jun-2000; LatestRevisionDate: 08-Jul-2005; LatestRevisionNote: Mech Layer 1 removed.; PackageReference: LED-0; Publisher: Altium Limited; PackageDescription: LED; 2 Leads
F1 = JFC1206-1300FS: Manufacturer: JDTfuse(集电通); Add into BOM: yes; Fuse Type: 快速熔断; Breaking Capacity @ Rated Voltage: 50A; Rated Voltage(DC): 24V/32V/63V/72V; Current Rating: 3A; Nominal Voltage Drop: 187mV; Melting I²t: 1.39; Nominal Cold Resistance: 53mΩ; Name: JFC1206-1300FS; Symbol: JFC1206-1300FS; Device: JFC1206-1300FS; LCSC Part Name: 3A 63V 快断; Supplier Part: C136347; Manufacturer Part: JFC1206-1300FS; Supplier Footprint: 1206; JLCPCB Part Class: Extended Part; Datasheet: https://atta.szlcsc.com/upload/public/pdf/source/20171023/C136347_15087480789771053481.pdf; Supplier: LCSC; Convert to PCB: yes; Product: 贴片式保险丝; Operating Temperature: -55°C ~ 125°C; Rated Voltage(AC): -
L46 L47 = Inductor: Code_IEC: 1005; Value: 10mH; Published: 8-Jun-2000; LatestRevisionDate: 29-May-2009; LatestRevisionNote: IPC-7351 Footprint Added.; PackageReference: 0402-A; Publisher: Altium Limited; PackageDescription: Chip Inductor; Code_JEITA: 0402
R50 R51 R53 R54 RX1 = Res1: Resistor; Value: 1K; Published: 8-Jun-2000; LatestRevisionDate: 17-Jul-2002; LatestRevisionNote: Re-released for DXP Platform.; PackageReference: AXIAL-0.3; Publisher: Altium Limited; PackageDescription: Axial Device, Thru-Hole; 2 Leads; 0.3 in Pin Spacing
R52 = Res3: Resistor; Published: 8-Jun-2000; LatestRevisionDate: 04-Mar-2005; LatestRevisionNote: PCB Footprint replaced.; PackageReference: J1-0603; Publisher: Altium Limited; Value: 10k
RX2 = Res1: Resistor; Published: 8-Jun-2000; LatestRevisionDate: 17-Jul-2002; LatestRevisionNote: Re-released for DXP Platform.; PackageReference: AXIAL-0.3; Publisher: Altium Limited; PackageDescription: Axial Device, Thru-Hole; 2 Leads; 0.3 in Pin Spacing; Value: 1K
U25 U28 = SY8121BABC: Manufacturer: silergy(矽力杰); Add into BOM: yes; Name: SY8121BABC; Symbol: SY8121BABC; Device: SY8121BABC; LCSC Part Name: SY8121BABC; Supplier Part: C3014423; Manufacturer Part: SY8121BABC; Supplier Footprint: SOT-23-6; JLCPCB Part Class: Extended Part; Datasheet: https://atta.szlcsc.com/upload/public/pdf/source/20220628/778B77D6DFC0D9CB89BA787A0CD3FE92.pdf; Supplier: LCSC; Convert to PCB: yes
U26 U27 U29-U36 = sgm2036

## Sheet MCU_SLAVE.SchDoc
size A4; SheetNumber: 6; SheetTotal: 6
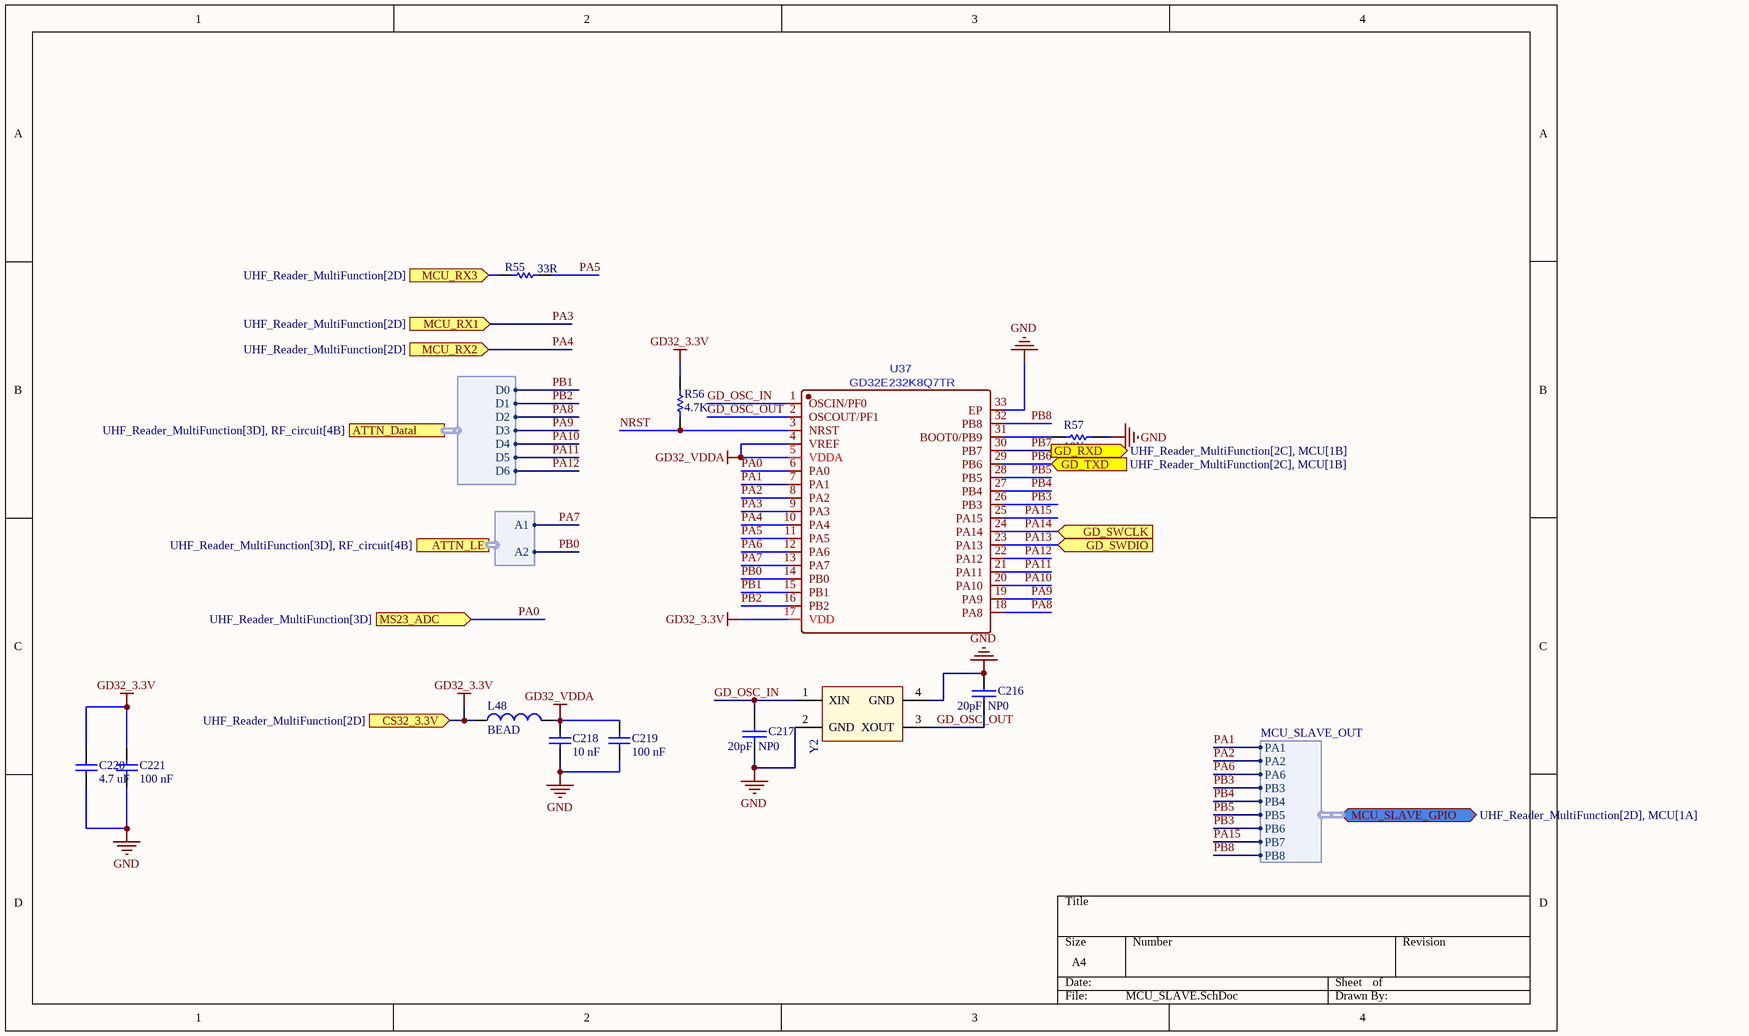
[diagram p11: MCU_SLAVE.SchDoc]

### Parts
C216  20pF  NP0  [0402_Z]
C217  20pF  NP0  [0402_Z]
C218  10 nF  [0402_Z]
C219  100 nF  [0402_Z]
C220  4.7 uF  [0603_Z]
C221  100 nF  [0402_Z]
L48  BEAD  [0603_Z]
R55  33R  [0402_Z]
R56  4.7K  [0402_Z]
R57  10K  [0402_Z]
U37  GD32E232K8Q7TR  [QFN-32_L4.0-W4.0-P0.40-TL-EP2.8]
Y2  48MHz无源晶振  [XTAL_2520]  (value not drawn)

### Ports
ATTN_Datal (harness ATTN1, see UHF_Reader_MultiFunction[3D], RF_circuit[4B]), ATTN_LE (harness ATTN_LE, see UHF_Reader_MultiFunction[3D], RF_circuit[4B]), CS32_3.3V (in, see UHF_Reader_MultiFunction[2D]), GD_RXD (out, see UHF_Reader_MultiFunction[2C], MCU[1B]), GD_SWCLK (in, see UHF_Reader_MultiFunction[2D], MCU[1B]), GD_SWDIO (in, see UHF_Reader_MultiFunction[2D]), GD_TXD (in, see UHF_Reader_MultiFunction[2C], MCU[1B]), MCU_RX1 (in, see UHF_Reader_MultiFunction[2D]), MCU_RX2 (in, see UHF_Reader_MultiFunction[2D]), MCU_RX3 (in, see UHF_Reader_MultiFunction[2D]), MCU_SLAVE_GPIO (bidir, harness MCU_SLAVE_OUT, see UHF_Reader_MultiFunction[2D], MCU[1A]), MS23_ADC (in, see UHF_Reader_MultiFunction[3D])

### Harnesses
ATTN1: D0, D1, D2, D3, D4, D5, D6
ATTN_LE: A1, A2
MCU_SLAVE_OUT: PA1, PA2, PA6, PB3, PB4, PB5, PB6, PB7, PB8

### Nets
GD32_3.3V: C220.2 C221.2 L48.1 R56.2 U37.17(VDD) ; port CS32_3.3V  [project net MCU_3V3]
GD32_VDDA: C218.2 C219.2 L48.2 U37.4(VREF) U37.5(VDDA)
GND: C216.2 C217.1 C218.1 C219.1 C220.1 C221.1 R57.1 U37.33(EP) Y2.2(GND) Y2.4(GND)
GD_OSC_IN: C217.2 U37.1(OSCIN/PF0) Y2.1(XIN)
GD_OSC_OUT: C216.1 U37.2(OSCOUT/PF1) Y2.3(XOUT)
NRST: R56.1 U37.3(NRST)
PA0: U37.6(PA0) ; port MS23_ADC
PA1: U37.7(PA1) ; port MCU_SLAVE_GPIO.PA1
PA2: U37.8(PA2) ; port MCU_SLAVE_GPIO.PA2
PA3: U37.9(PA3) ; port MCU_RX1
PA4: U37.10(PA4) ; port MCU_RX2
PA5: R55.1 U37.11(PA5)
PA6: U37.12(PA6) ; port MCU_SLAVE_GPIO.PA6
PA7: U37.13(PA7) ; port ATTN_LE.A1  [project net LE_A1]
PA8: U37.18(PA8) ; port ATTN_Datal.D2  [project net ATTN1_D2]
PA9: U37.19(PA9) ; port ATTN_Datal.D3  [project net ATTN1_D3]
PA10: U37.20(PA10) ; port ATTN_Datal.D4  [project net ATTN1_D4]
PA11: U37.21(PA11) ; port ATTN_Datal.D5  [project net ATTN1_D5]
PA12: U37.22(PA12) ; port ATTN_Datal.D6  [project net ATTN1_D6]
PA13: U37.23(PA13) ; port GD_SWDIO
PA14: U37.24(PA14) ; port GD_SWCLK
PA15: U37.25(PA15) ; port MCU_SLAVE_GPIO.PB7
PB0: U37.14(PB0) ; port ATTN_LE.A2  [project net LE_A2]
PB1: U37.15(PB1) ; port ATTN_Datal.D0  [project net ATTN1_D0]
PB2: U37.16(PB2) ; port ATTN_Datal.D1  [project net ATTN1_D1]
PB3: U37.26(PB3) ; port MCU_SLAVE_GPIO.PB3, port MCU_SLAVE_GPIO.PB6
PB4: U37.27(PB4) ; port MCU_SLAVE_GPIO.PB4
PB5: U37.28(PB5) ; port MCU_SLAVE_GPIO.PB5
PB6: U37.29(PB6) ; port GD_TXD
PB7: U37.30(PB7) ; port GD_RXD
PB8: U37.32(PB8) ; port MCU_SLAVE_GPIO.PB8
PE1: R55.2 ; port MCU_RX3
NetR57_2: R57.2 U37.31(BOOT0/PB9)

### Library data of the parts
C216 C217 = CAP: 0402; Value: 20pF  NP0
C218-C221 = Cap: Capacitor; Value: 100pF; Published: 8-Jun-2000; LatestRevisionDate: 17-Jul-2002; LatestRevisionNote: Re-released for DXP Platform.; PackageReference: RAD-0.3; Publisher: Altium Limited; PackageDescription: Radial Cap, Thru-Hole; 2 Leads; 0.3 in Pin Spacing
L48 = Inductor: Code_IEC: 1005; Value: 10mH; Published: 8-Jun-2000; LatestRevisionDate: 29-May-2009; LatestRevisionNote: IPC-7351 Footprint Added.; PackageReference: 0402-A; Publisher: Altium Limited; PackageDescription: Chip Inductor; Code_JEITA: 0402
R55 = Res: 0402; Value: 100R; Published: 8-Jun-2000; Revision: July-2002: Re-released for DXP Platform.; Publisher: Altium Limited
R56 R57 = Res1: Resistor; Value: 1K; Published: 8-Jun-2000; LatestRevisionDate: 17-Jul-2002; LatestRevisionNote: Re-released for DXP Platform.; PackageReference: AXIAL-0.3; Publisher: Altium Limited; PackageDescription: Axial Device, Thru-Hole; 2 Leads; 0.3 in Pin Spacing
Y2 = XTAL 3225: as Y1 on sheet MCU

## Nets that join several sheets
GND: FMRD1616E (64 pins), RF_circuit (167 pins), MCU (14 pins), Power_Sch (44 pins), MCU_SLAVE (10 pins)
MCU_3V3: MCU (L1.1), Power_Sch (C203.1 R52.2 U30.5), MCU_SLAVE (5 pins)
VCC_+1.8 V: FMRD1616E (L21.1 L30.1 L33.1 R16.1), Power_Sch (C213.1 U35.5)
VCC_+3.3 V: FMRD1616E (9 pins), Power_Sch (C201.1 U29.5)
VCC_SGM_SPDT: RF_circuit (8 pins), Power_Sch (C211.1 U34.5)
VDD_DPDT: RF_circuit (7 pins), Power_Sch (C215.1 U36.5)
ADP_IN: RF_circuit (R27.1), Power_Sch (9 pins)
ATTN1_D0: RF_circuit (C129.1 C161.1 U16.1 U21.1), MCU_SLAVE (U37.15)
ATTN1_D1: RF_circuit (C130.2 C162.2 U16.24 U21.24), MCU_SLAVE (U37.16)
ATTN1_D2: RF_circuit (C132.2 C163.2 U16.23 U21.23), MCU_SLAVE (U37.18)
ATTN1_D3: RF_circuit (C133.2 C164.2 U16.22 U21.22), MCU_SLAVE (U37.19)
ATTN1_D4: RF_circuit (C135.1 C165.1 U16.21 U21.21), MCU_SLAVE (U37.20)
ATTN1_D5: RF_circuit (C138.1 C166.1 U16.20 U21.20), MCU_SLAVE (U37.21)
ATTN1_D6: RF_circuit (C139.1 C167.1 U16.19 U21.19), MCU_SLAVE (U37.22)
LE_A1: RF_circuit (R43.2), MCU_SLAVE (U37.13)
LE_A2: RF_circuit (R47.2), MCU_SLAVE (U37.14)
LNA_5V: RF_circuit (12 pins), Power_Sch (C192.1 U26.5)
LO_LNA_5V: RF_circuit (5 pins), Power_Sch (C205.1 U31.5)
NetC89_2: RF_circuit (C89.2 C91.2 L37.2 R25.2), Power_Sch (C197.1 U27.5)
NetC92_2: RF_circuit (C92.2 C95.2 R28.2), Power_Sch (C209.1 RX1.2 U33.5)
NetC179_1: FMRD1616E (P2.5), RF_circuit (C179.1)
NetC180_1: FMRD1616E (U2.1), RF_circuit (C180.1)
NetC207_1: FMRD1616E (L4.2), Power_Sch (C207.1 U32.5)
NetF1_1: MCU (P1.1 P1.2), Power_Sch (F1.1)
NetR11_1: FMRD1616E (R11.1), MCU (U1.38)
NetR22_1: FMRD1616E (R22.1), MCU (U1.4)
NetR24_1: RF_circuit (R24.1), MCU (U1.3)
NetR29_1: FMRD1616E (U5.1), RF_circuit (R29.1 R30.2)
NetU1_9: MCU (U1.9), Power_Sch (U26.3)
NIRQ0: FMRD1616E (U4.30), MCU (U1.40)
PA0: RF_circuit (C140.1 U15.3 U15.6), MCU_SLAVE (U37.6)
PA3: MCU (R2.1), MCU_SLAVE (U37.9)
PA4: MCU (R1.2), MCU_SLAVE (U37.10)
PA13: MCU (P1.17), MCU_SLAVE (U37.23)
PA14: MCU (P1.16), MCU_SLAVE (U37.24)
PB6: MCU (P1.11), MCU_SLAVE (U37.29)
PB7: MCU (P1.12), MCU_SLAVE (U37.30)
PE1: MCU (P1.14 U1.22), MCU_SLAVE (R55.2)
QSPI_D0: FMRD1616E (R6.1), MCU (U1.32)
QSPI_D1: FMRD1616E (R7.1), MCU (U1.33)
QSPI_D2: FMRD1616E (R8.1), MCU (U1.34)
QSPI_D3: FMRD1616E (R9.1), MCU (U1.35)
QSPI_SCK: FMRD1616E (R5.1), MCU (U1.31)
QSPI_SSN: FMRD1616E (R10.1), MCU (U1.36)
TCXO_EN: FMRD1616E (U4.46), MCU (U1.39)
TX_EN: MCU (U1.6), Power_Sch (U27.3 U33.3)
V4_MCU: RF_circuit (R35.1 U14.2), MCU (U1.1)